# Altium schematic sheet LDO线性7805全分立设计.SchDoc
size 1524 x 1524 mm; SheetNumber: 8; SheetTotal: 17
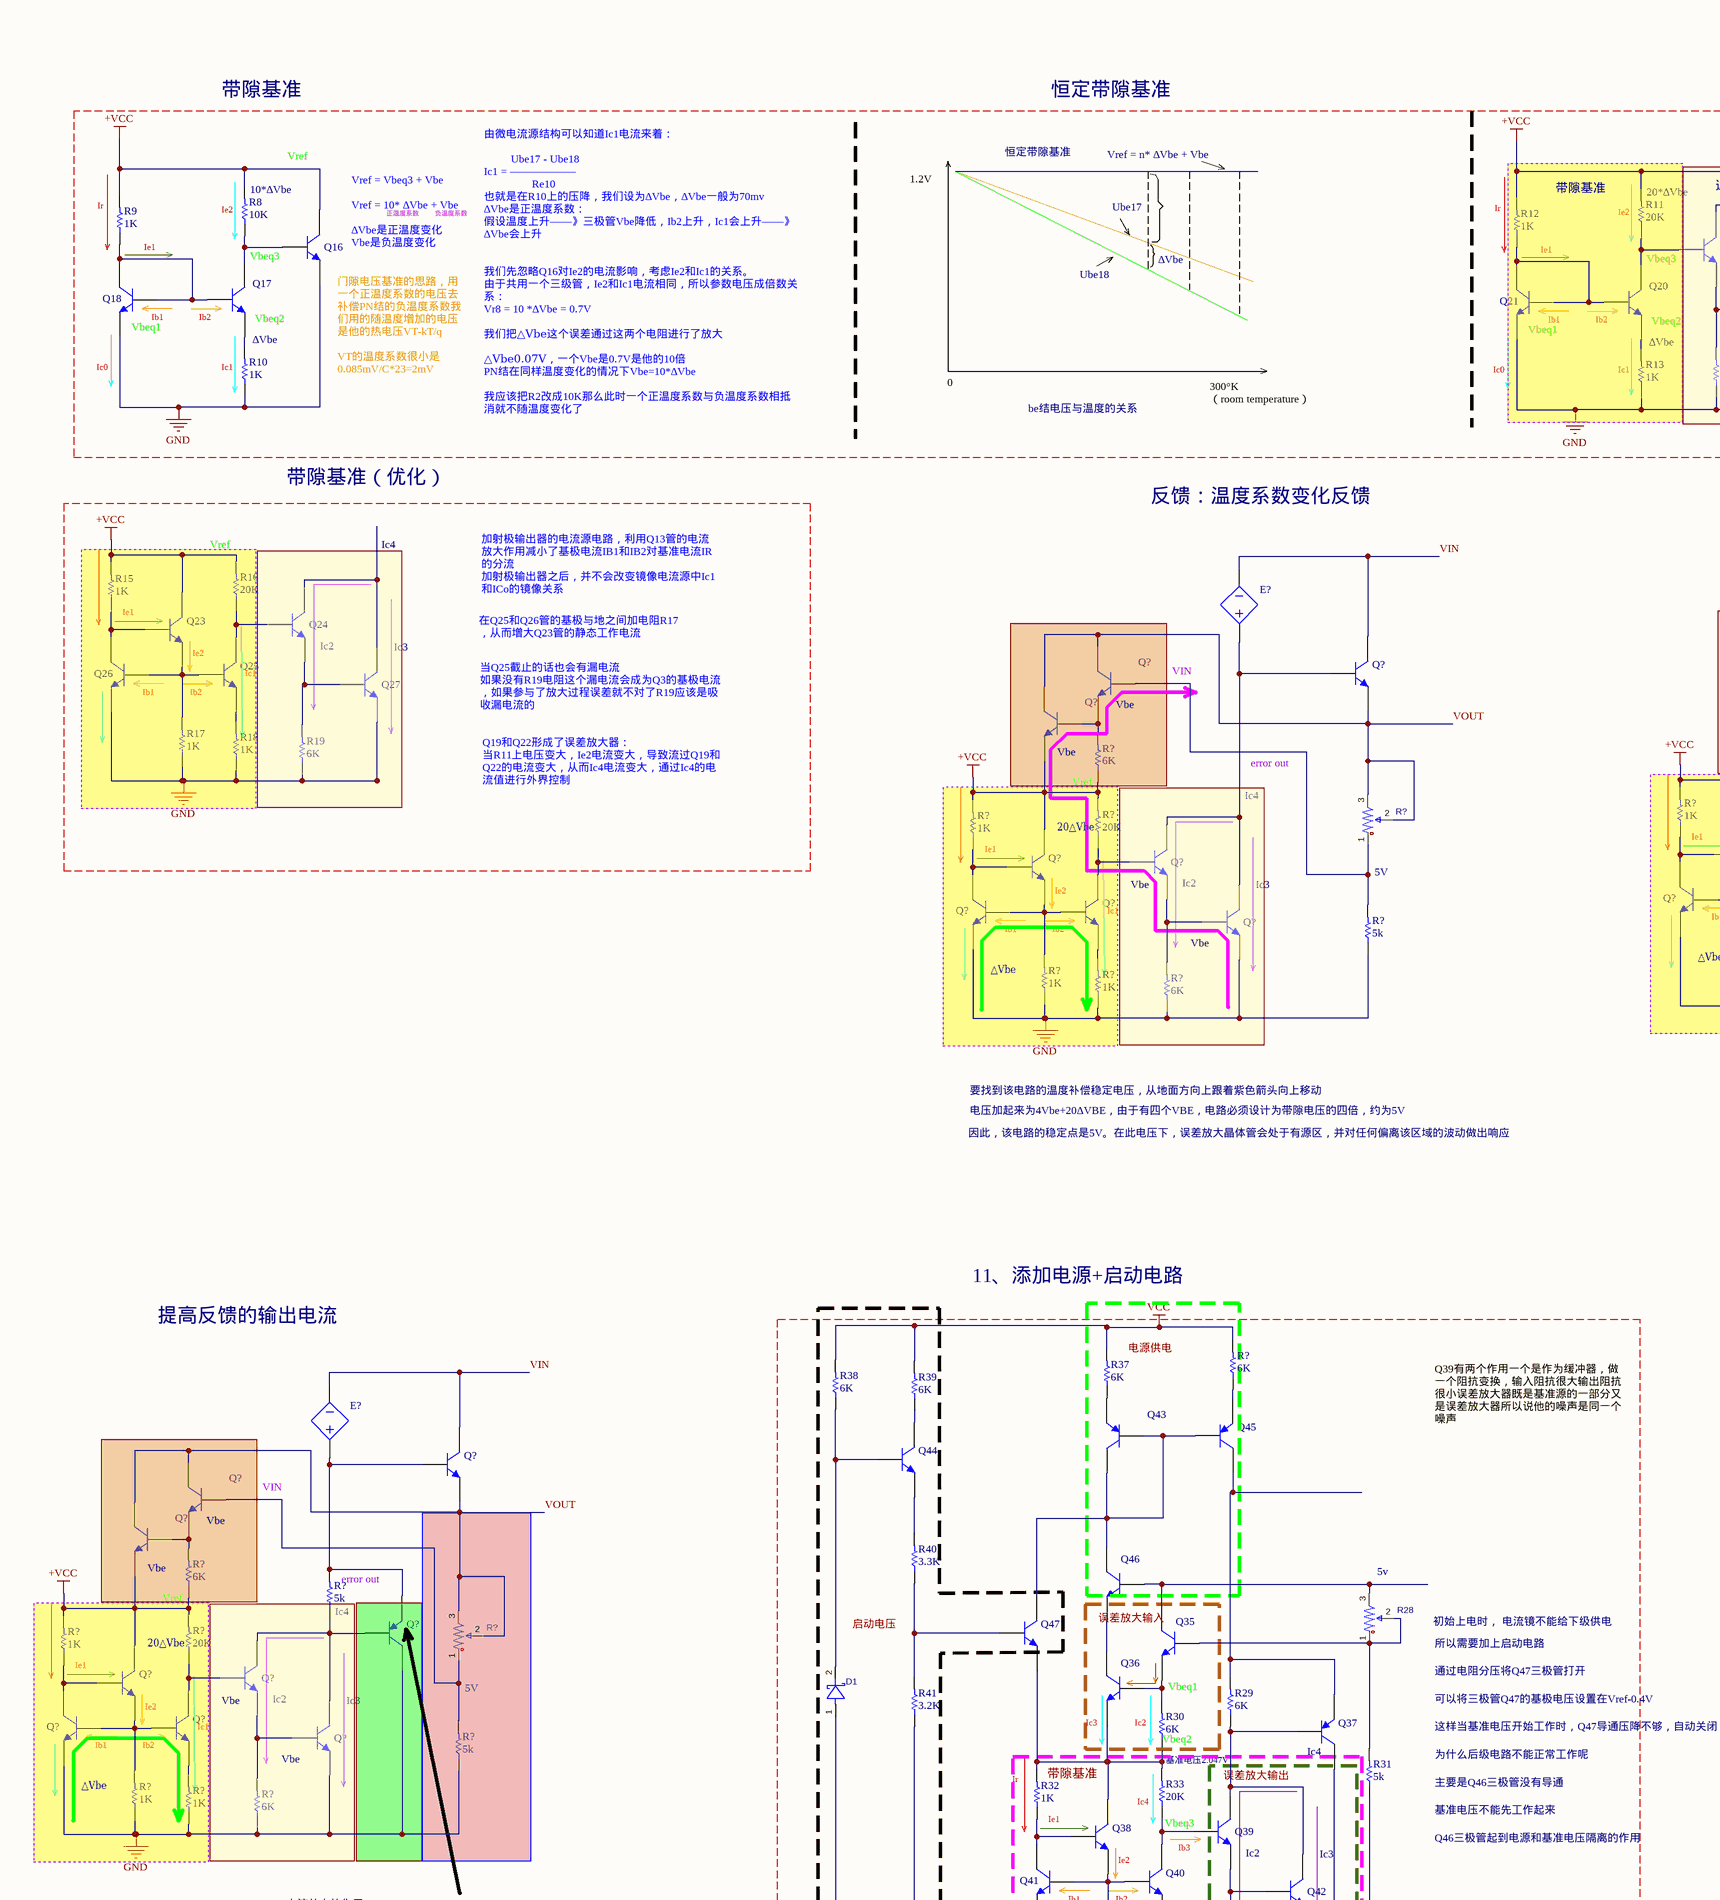
[diagram p0: LDO线性7805全分立设计.SchDoc, top column 1 of 4]
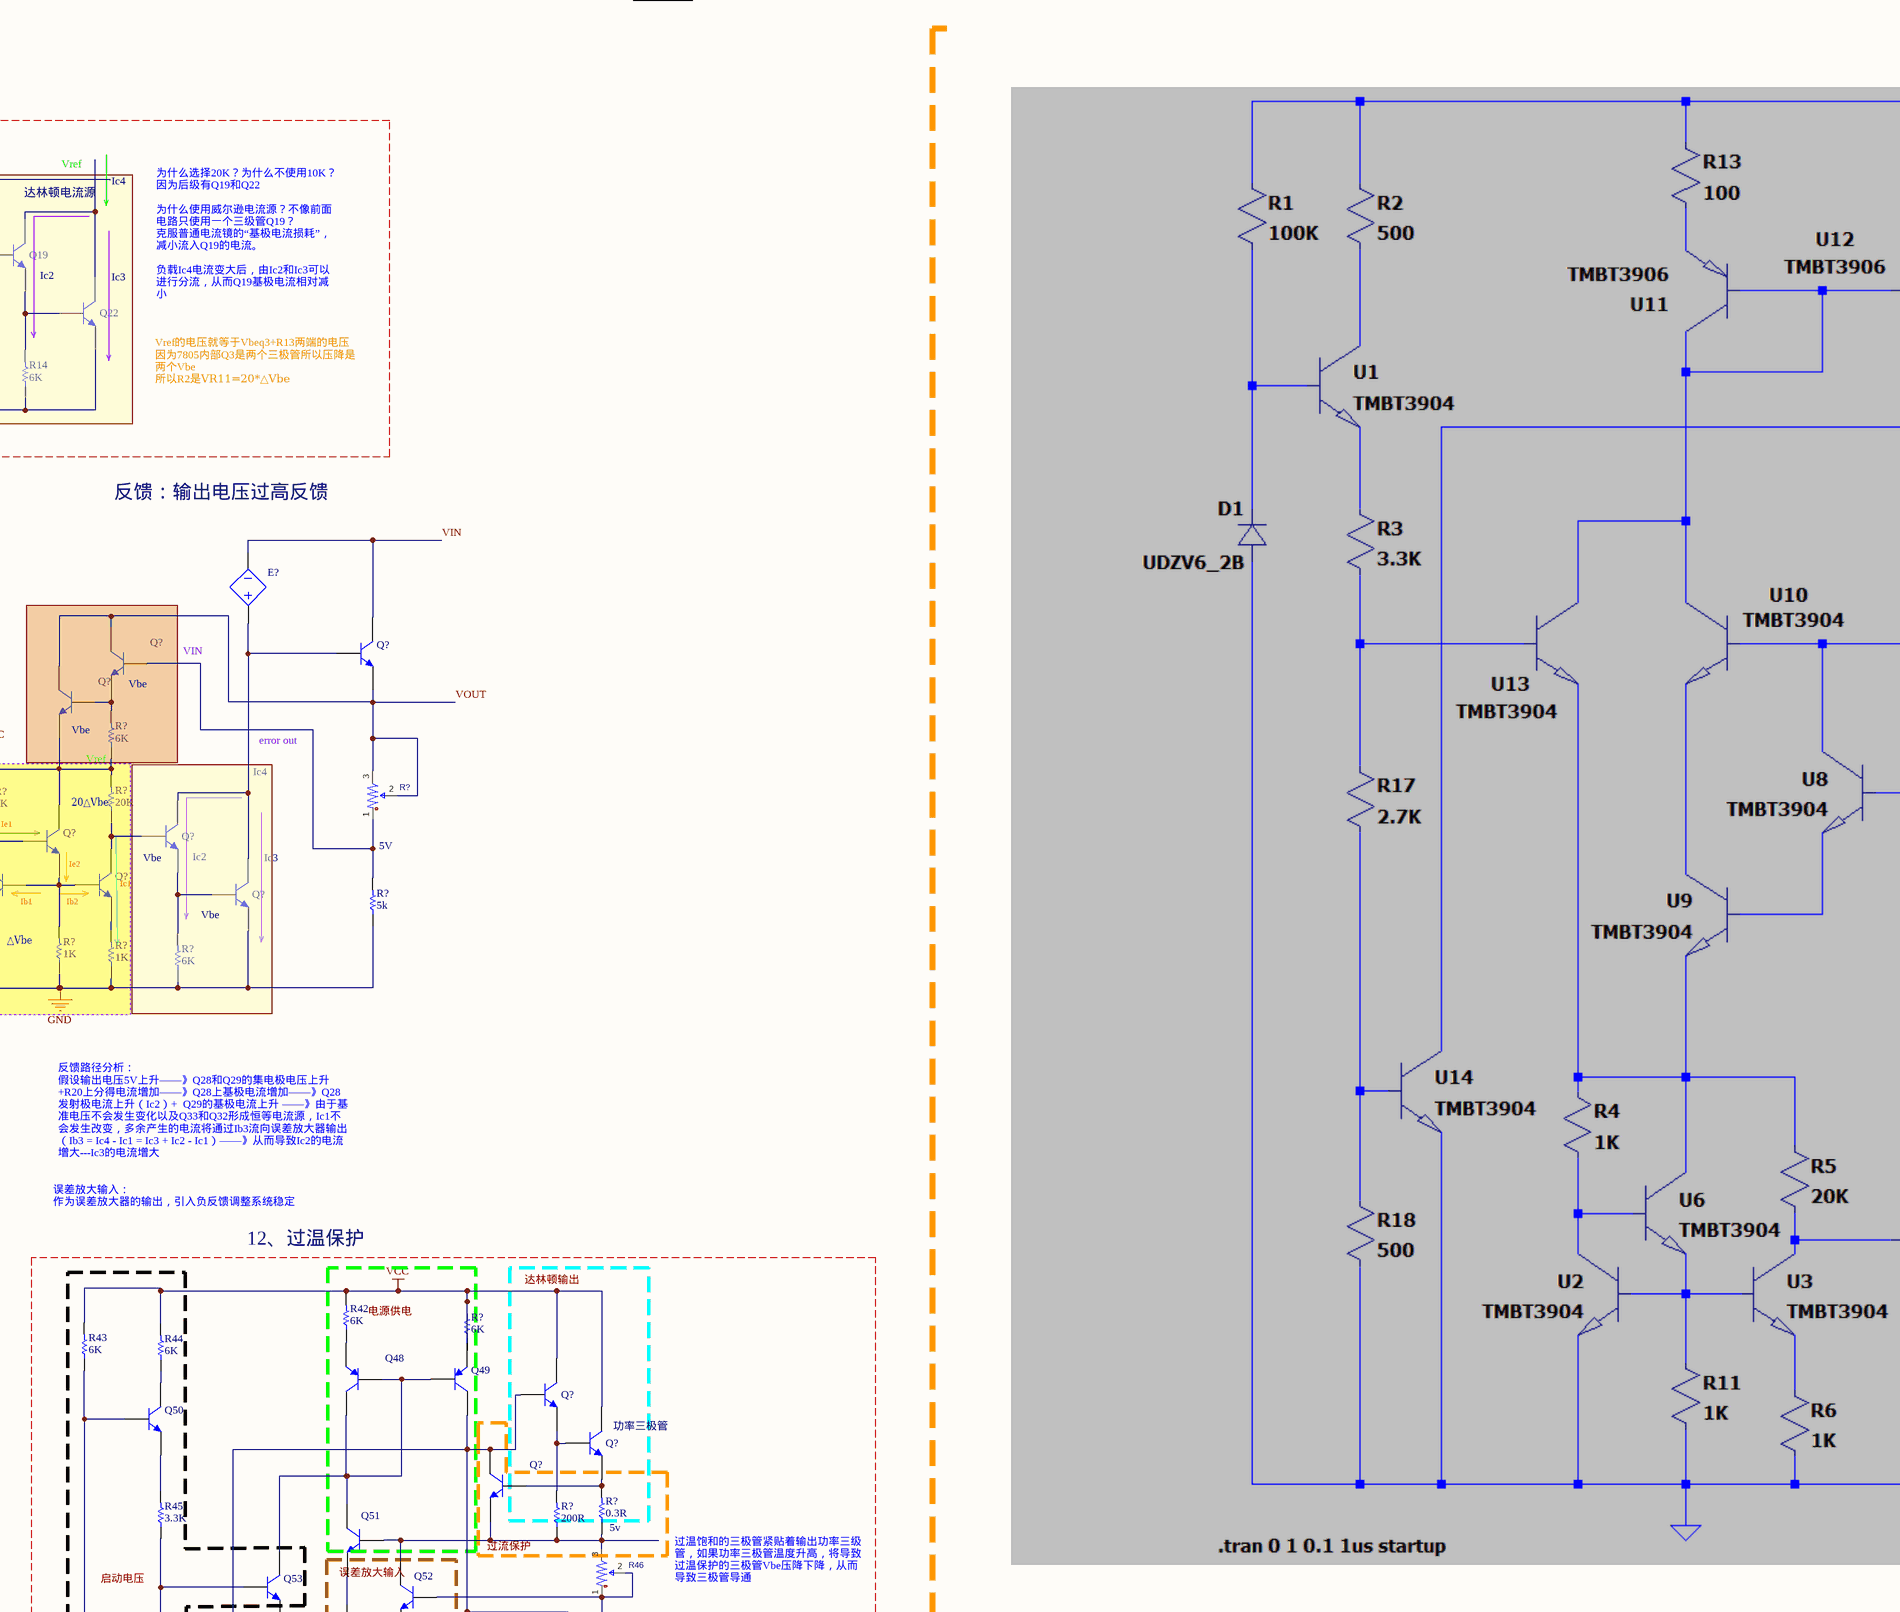
[diagram p1: LDO线性7805全分立设计.SchDoc, top column 2 of 4]
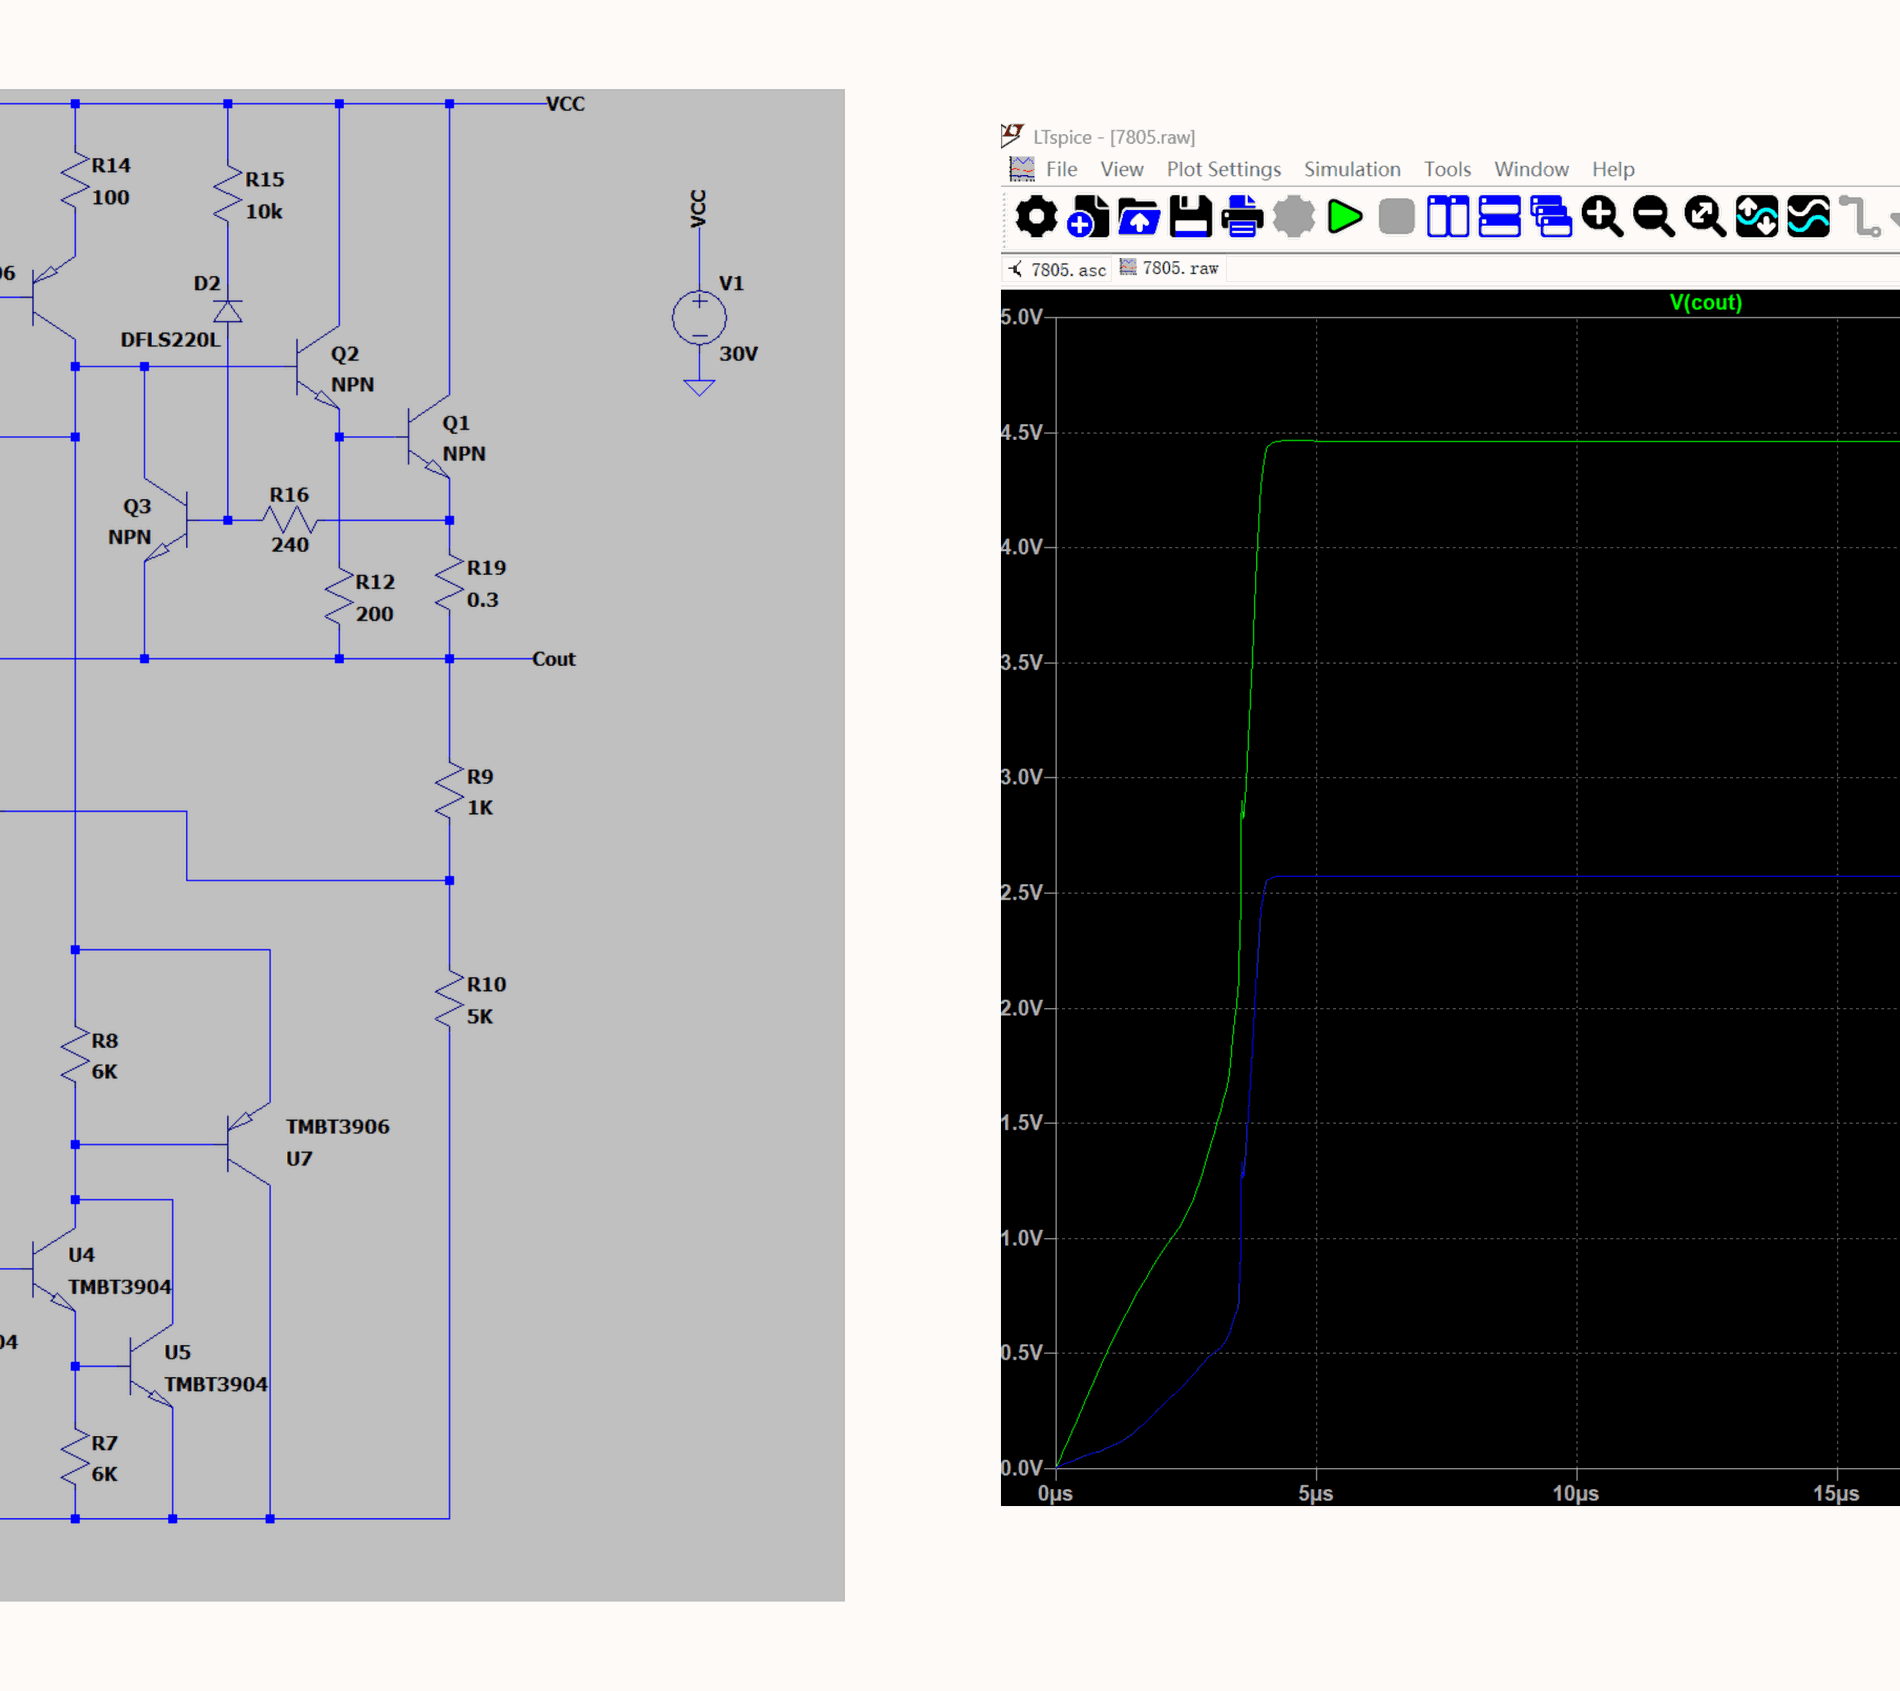
[diagram p2: LDO线性7805全分立设计.SchDoc, top column 3 of 4]
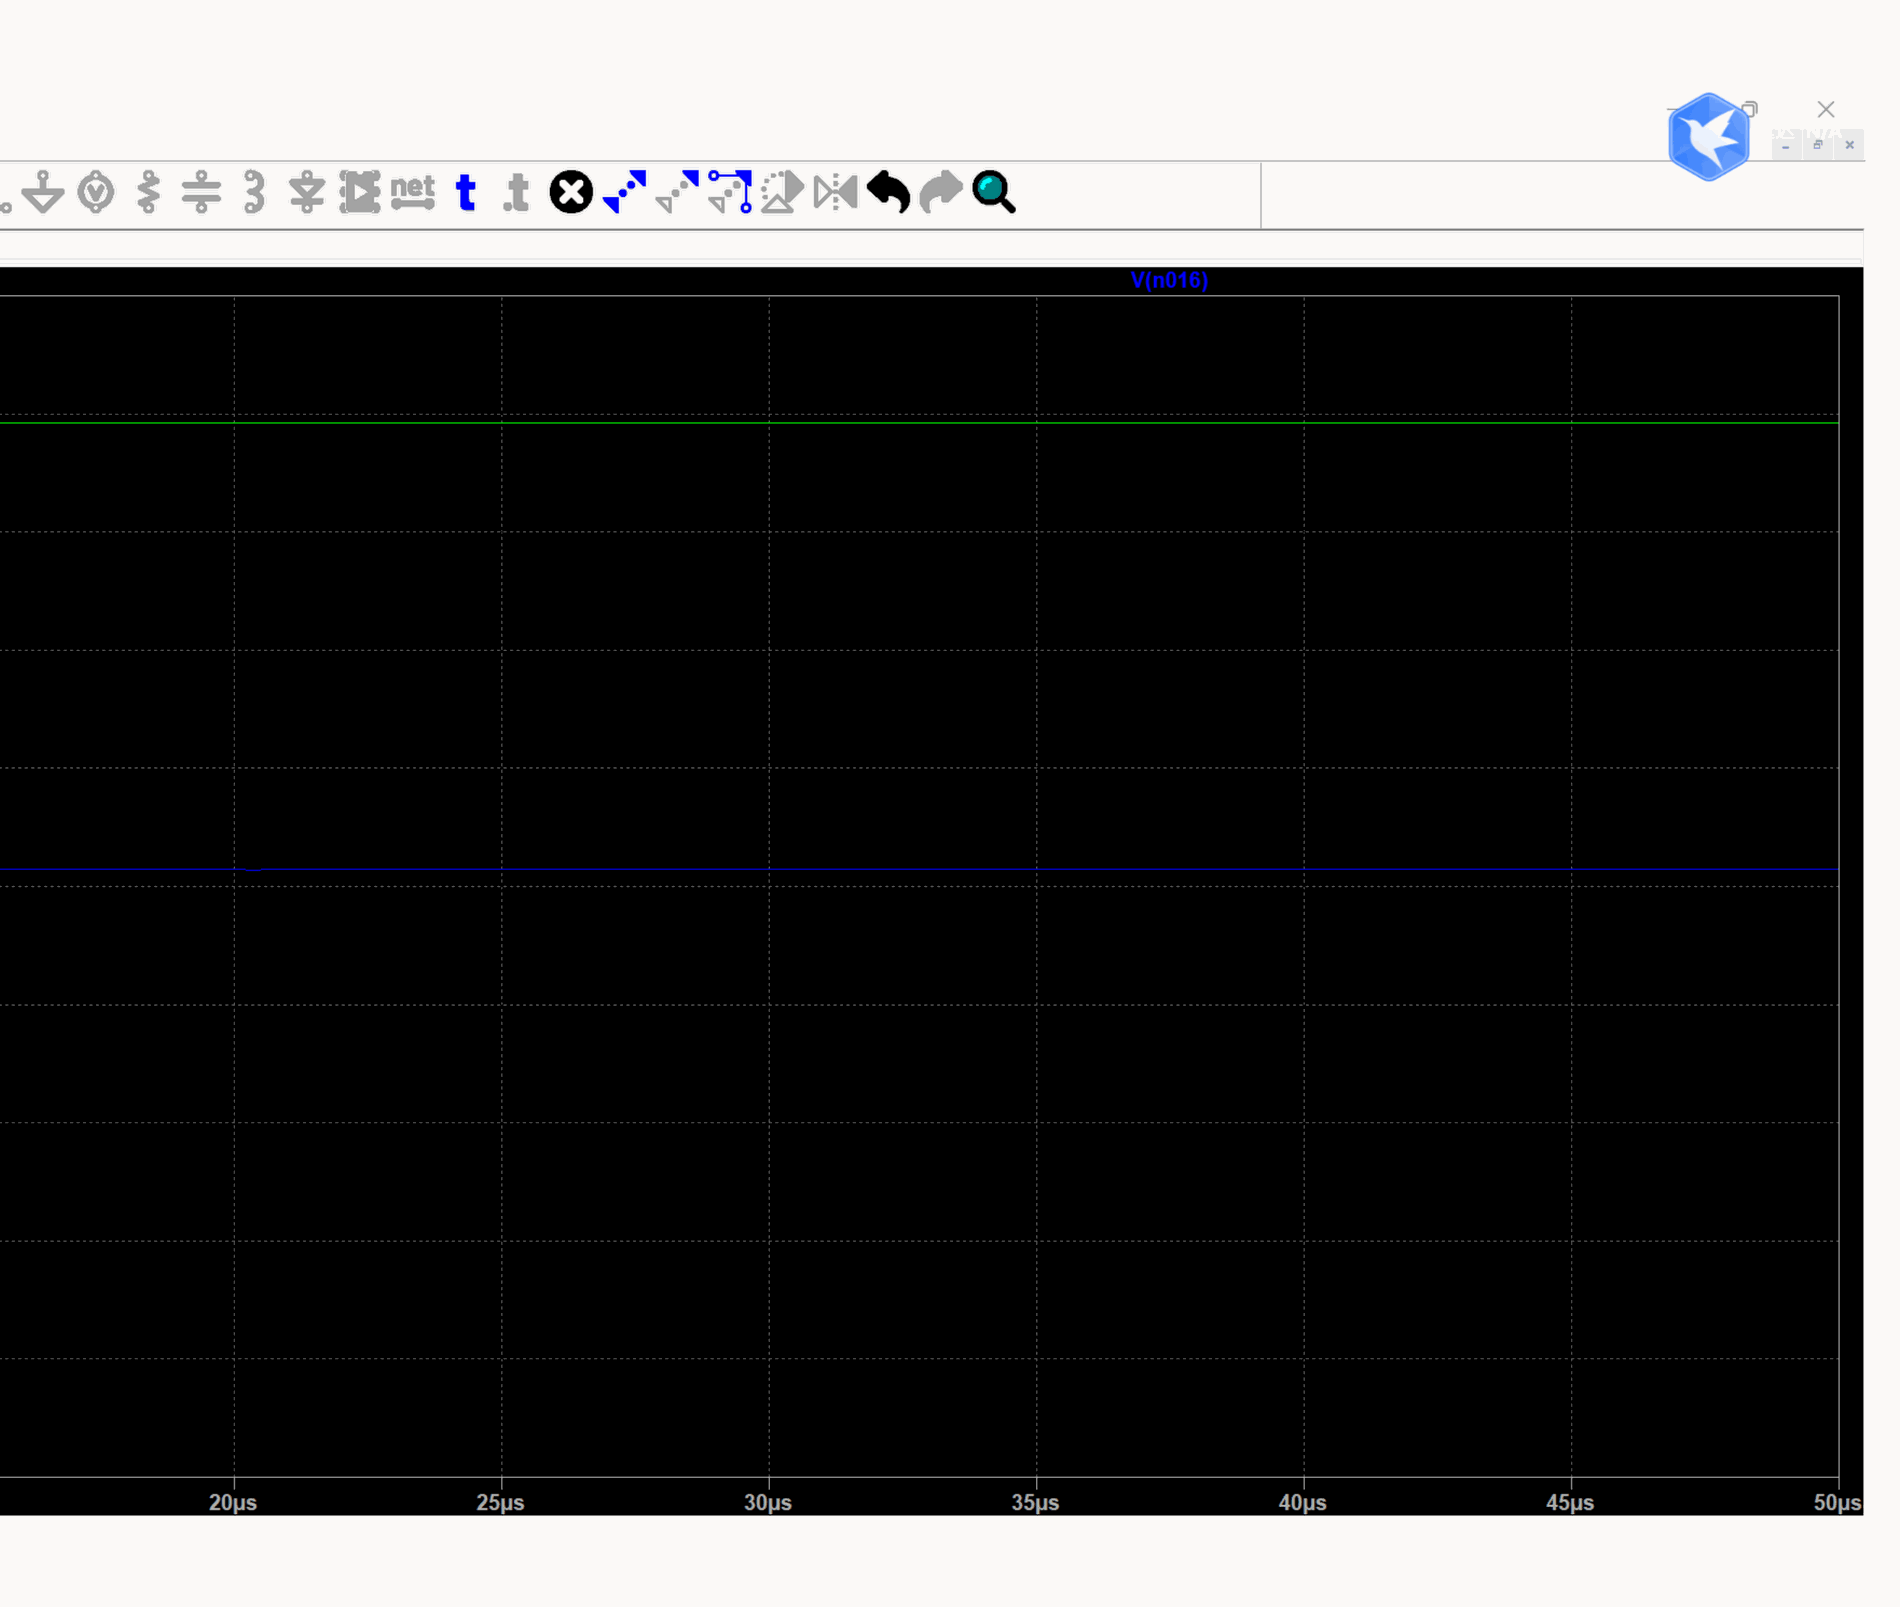
[diagram p3: LDO线性7805全分立设计.SchDoc, top column 4 of 4]
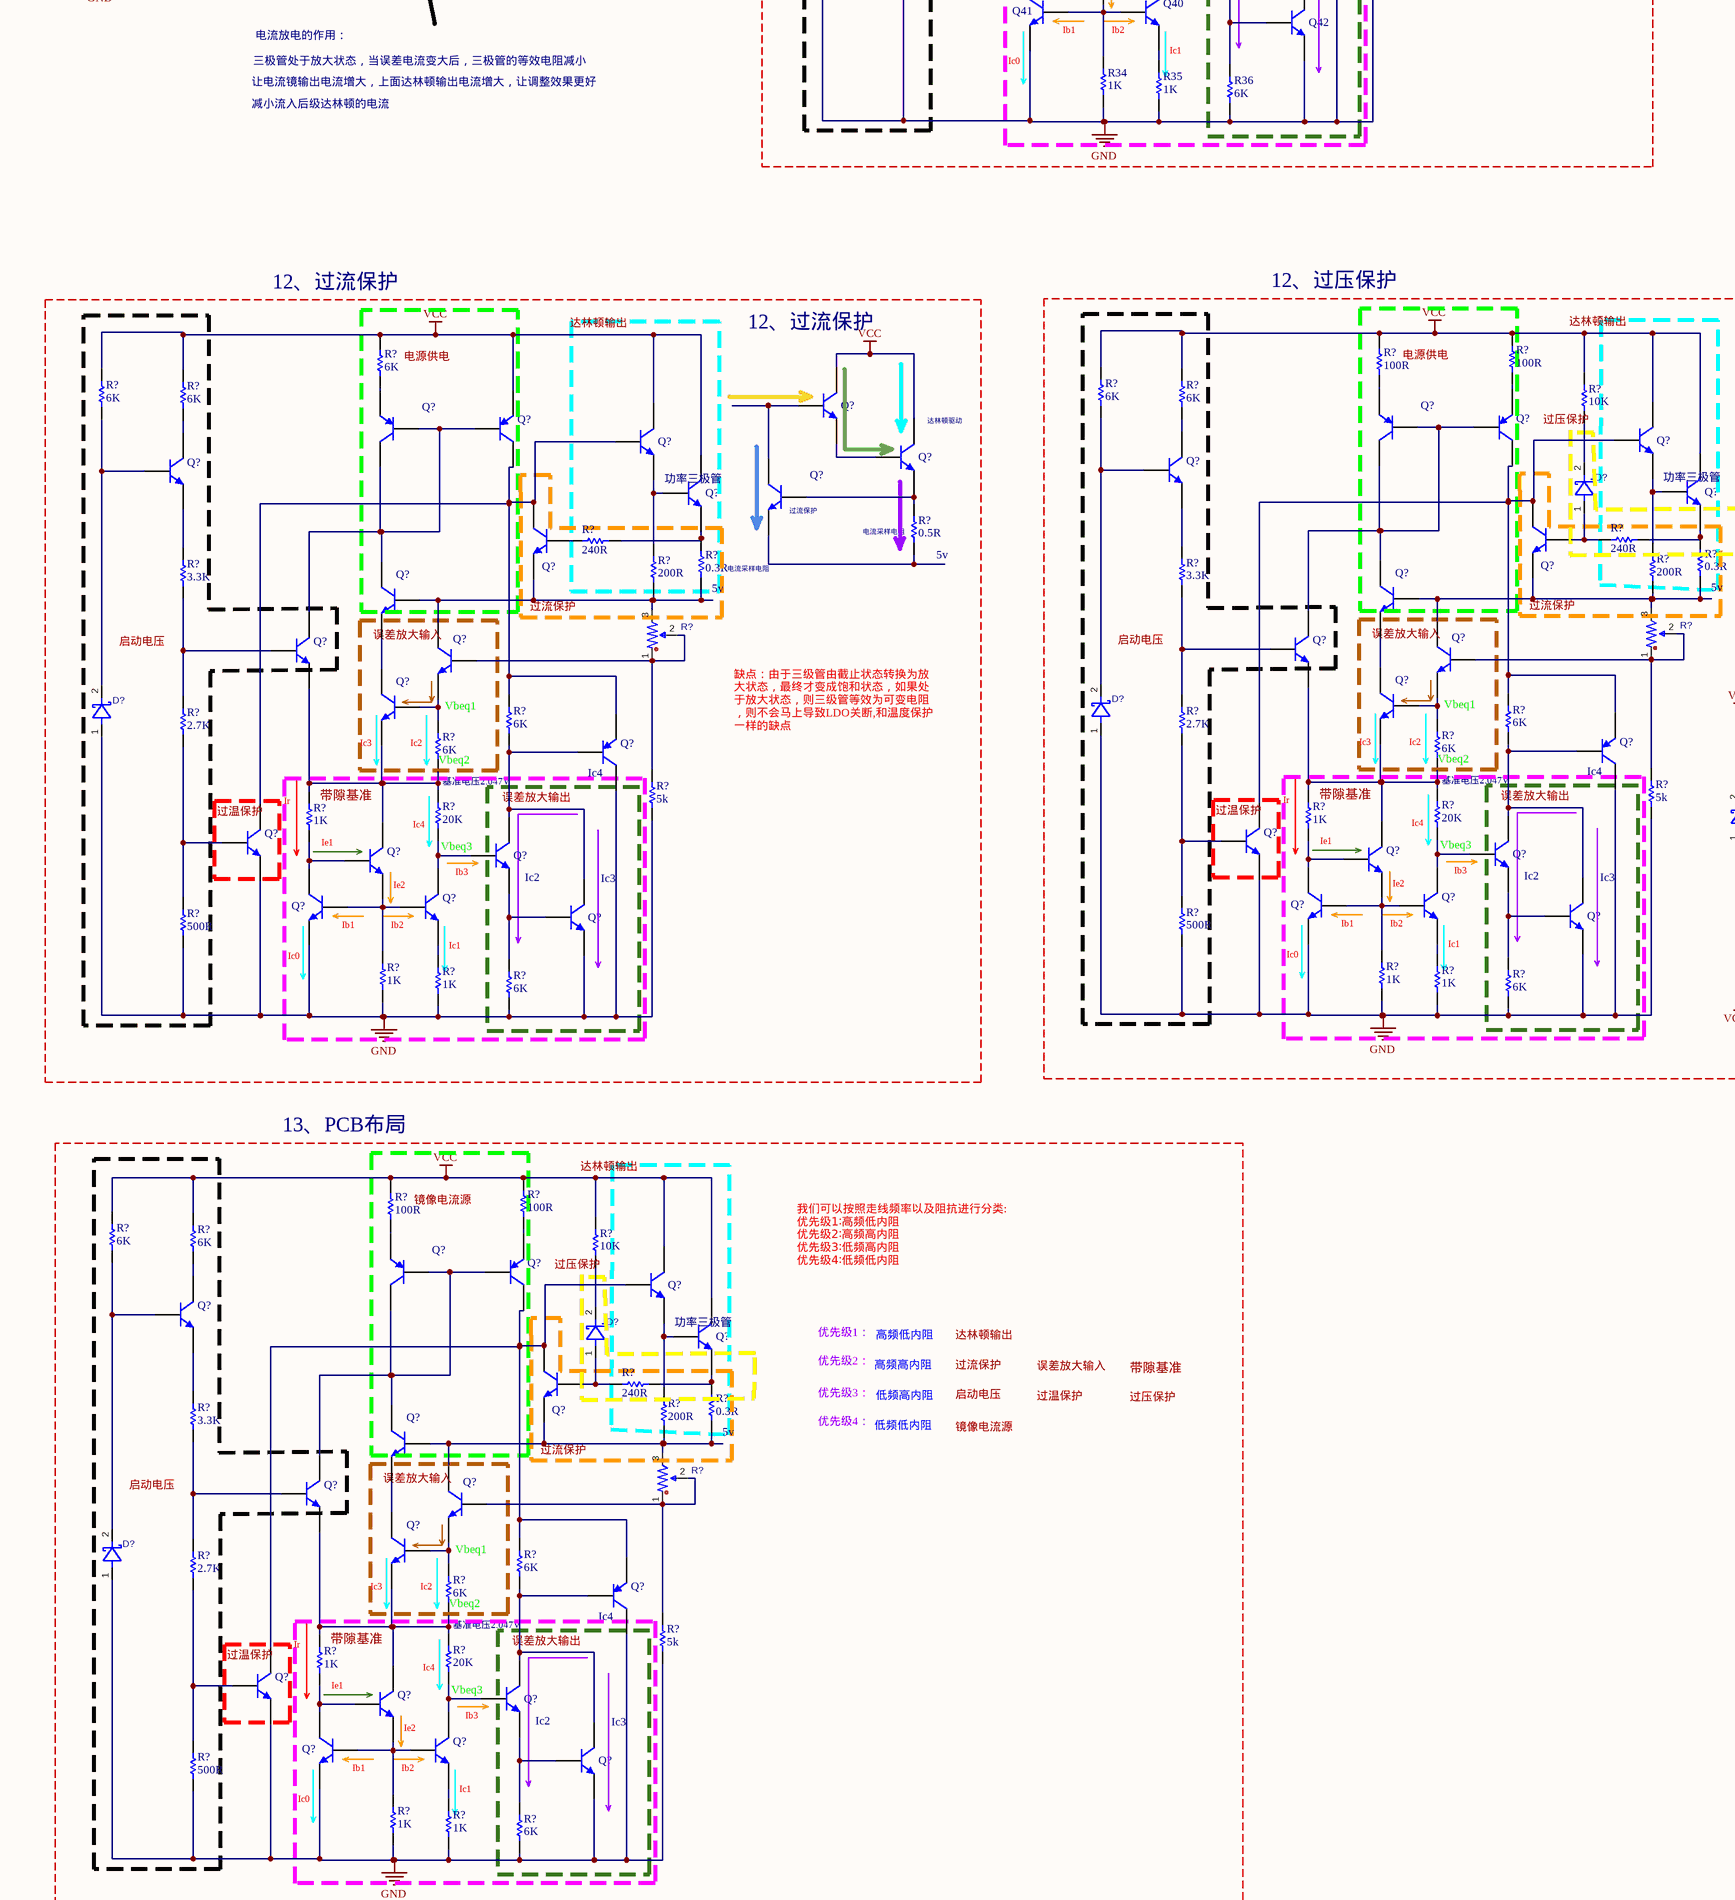
[diagram p4: LDO线性7805全分立设计.SchDoc, centre column 1 of 4]
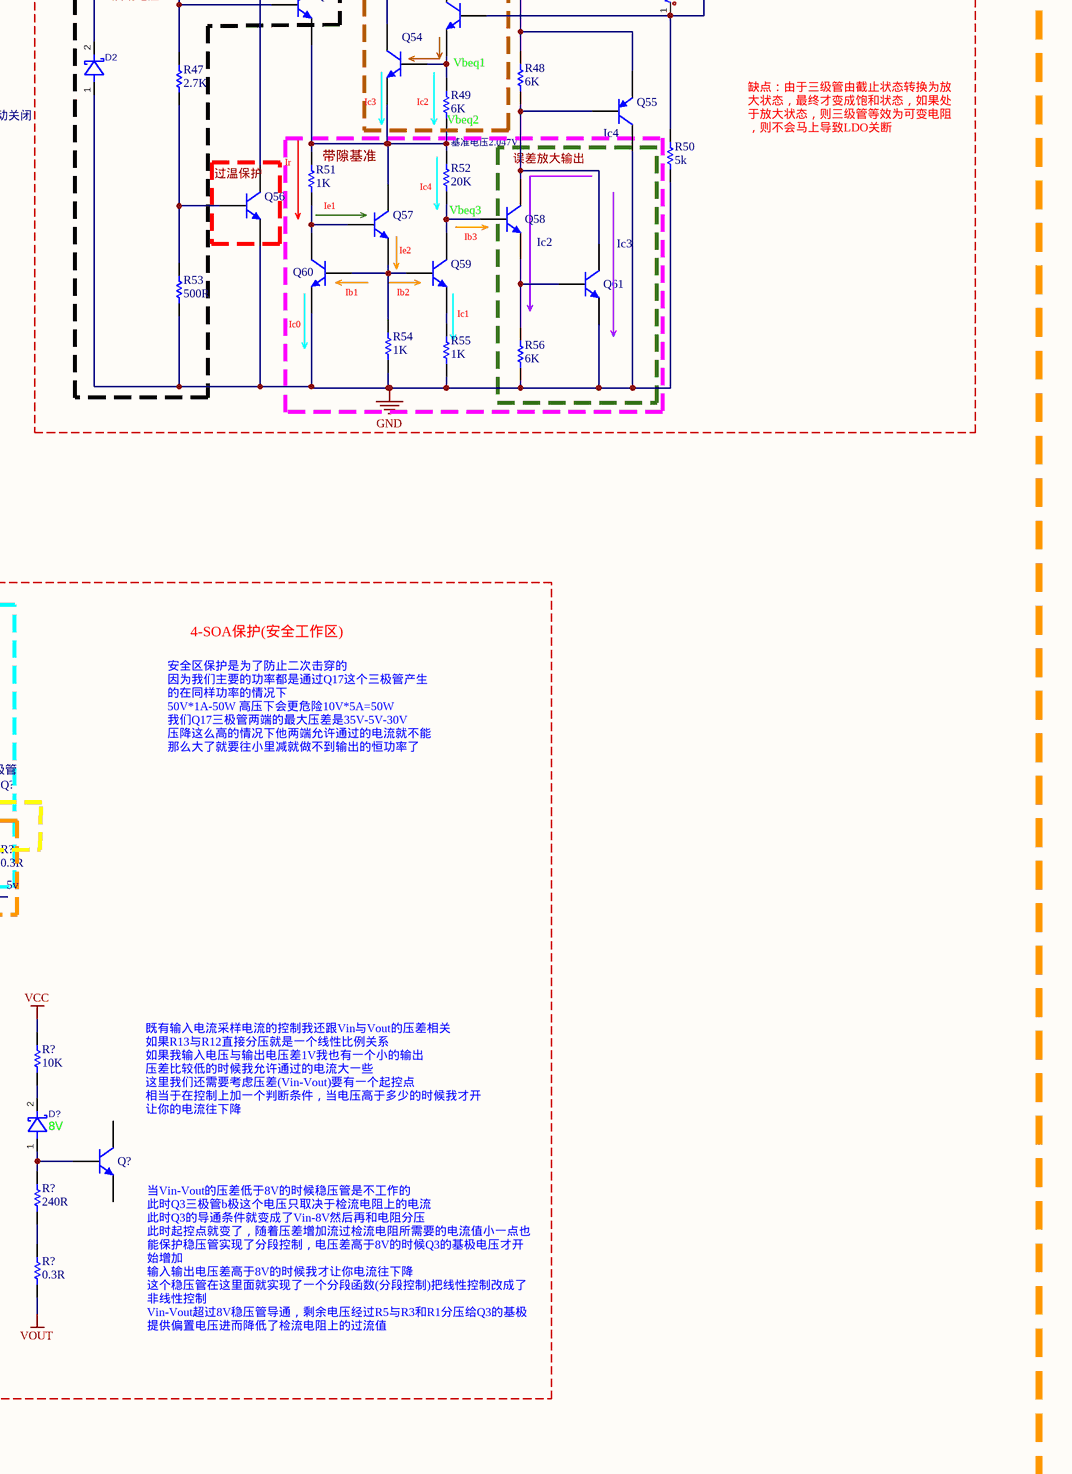
[diagram p5: LDO线性7805全分立设计.SchDoc, centre column 2 of 4]
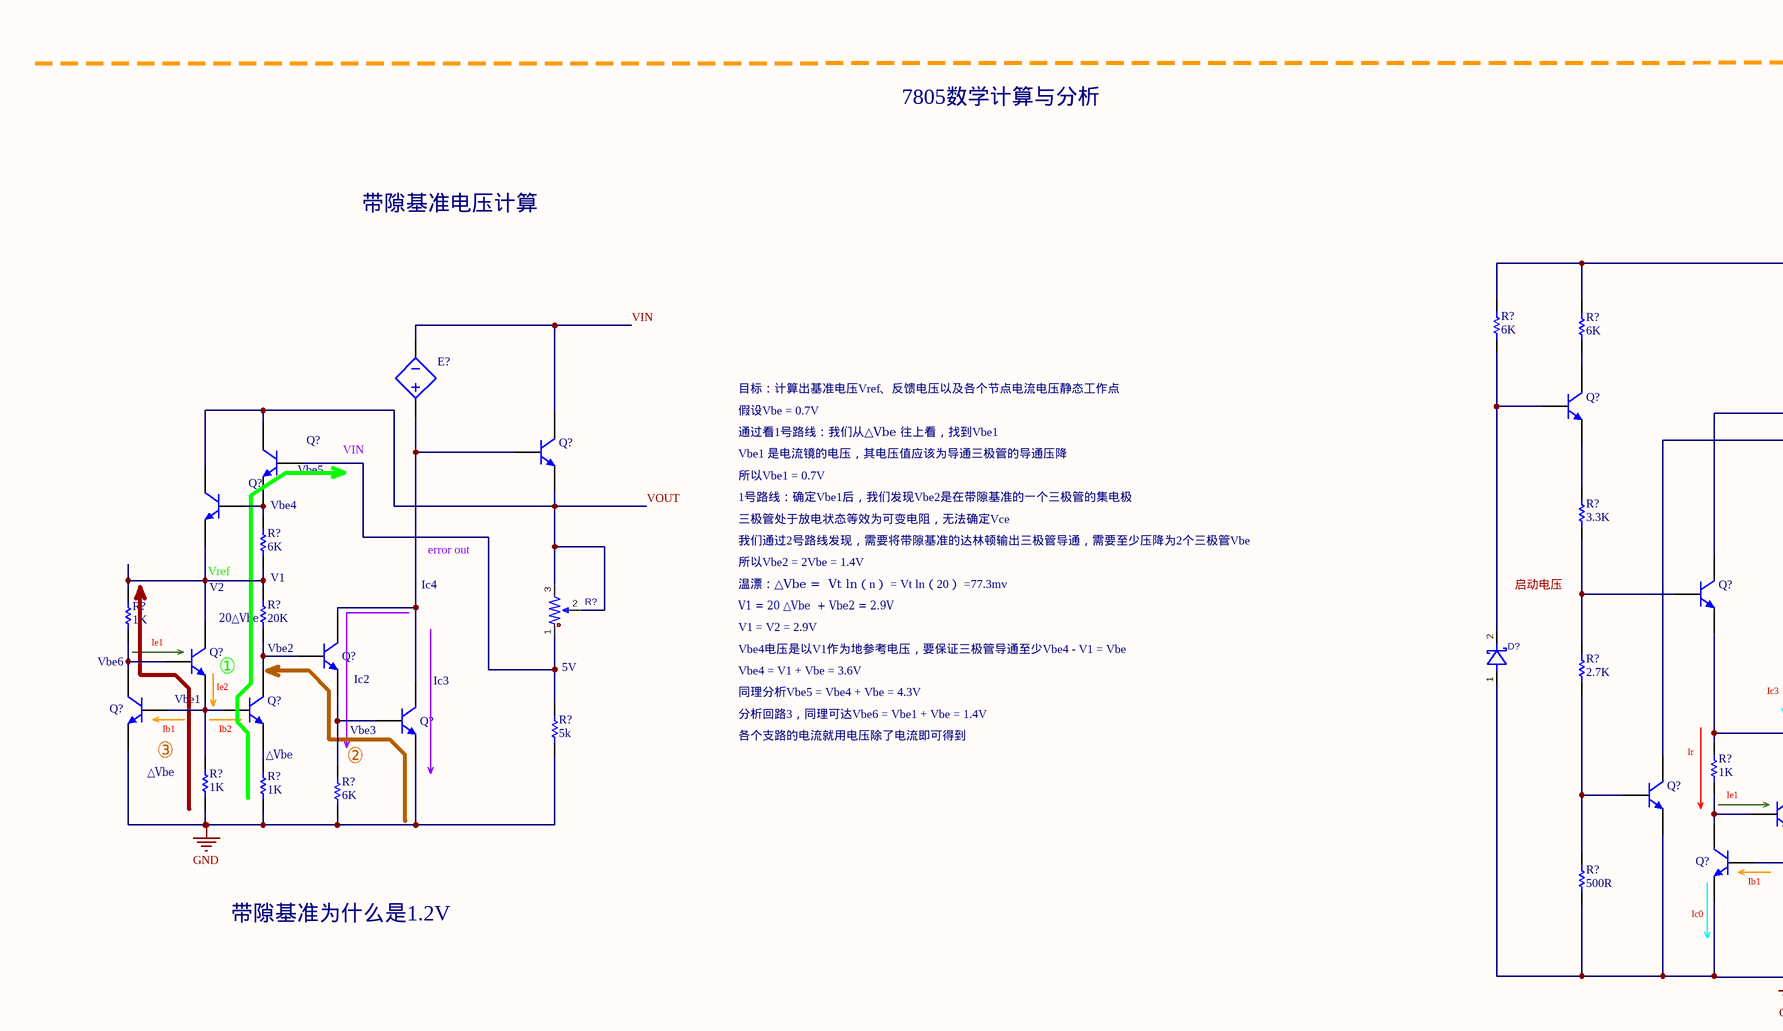
[diagram p6: LDO线性7805全分立设计.SchDoc, bottom column 1 of 4]
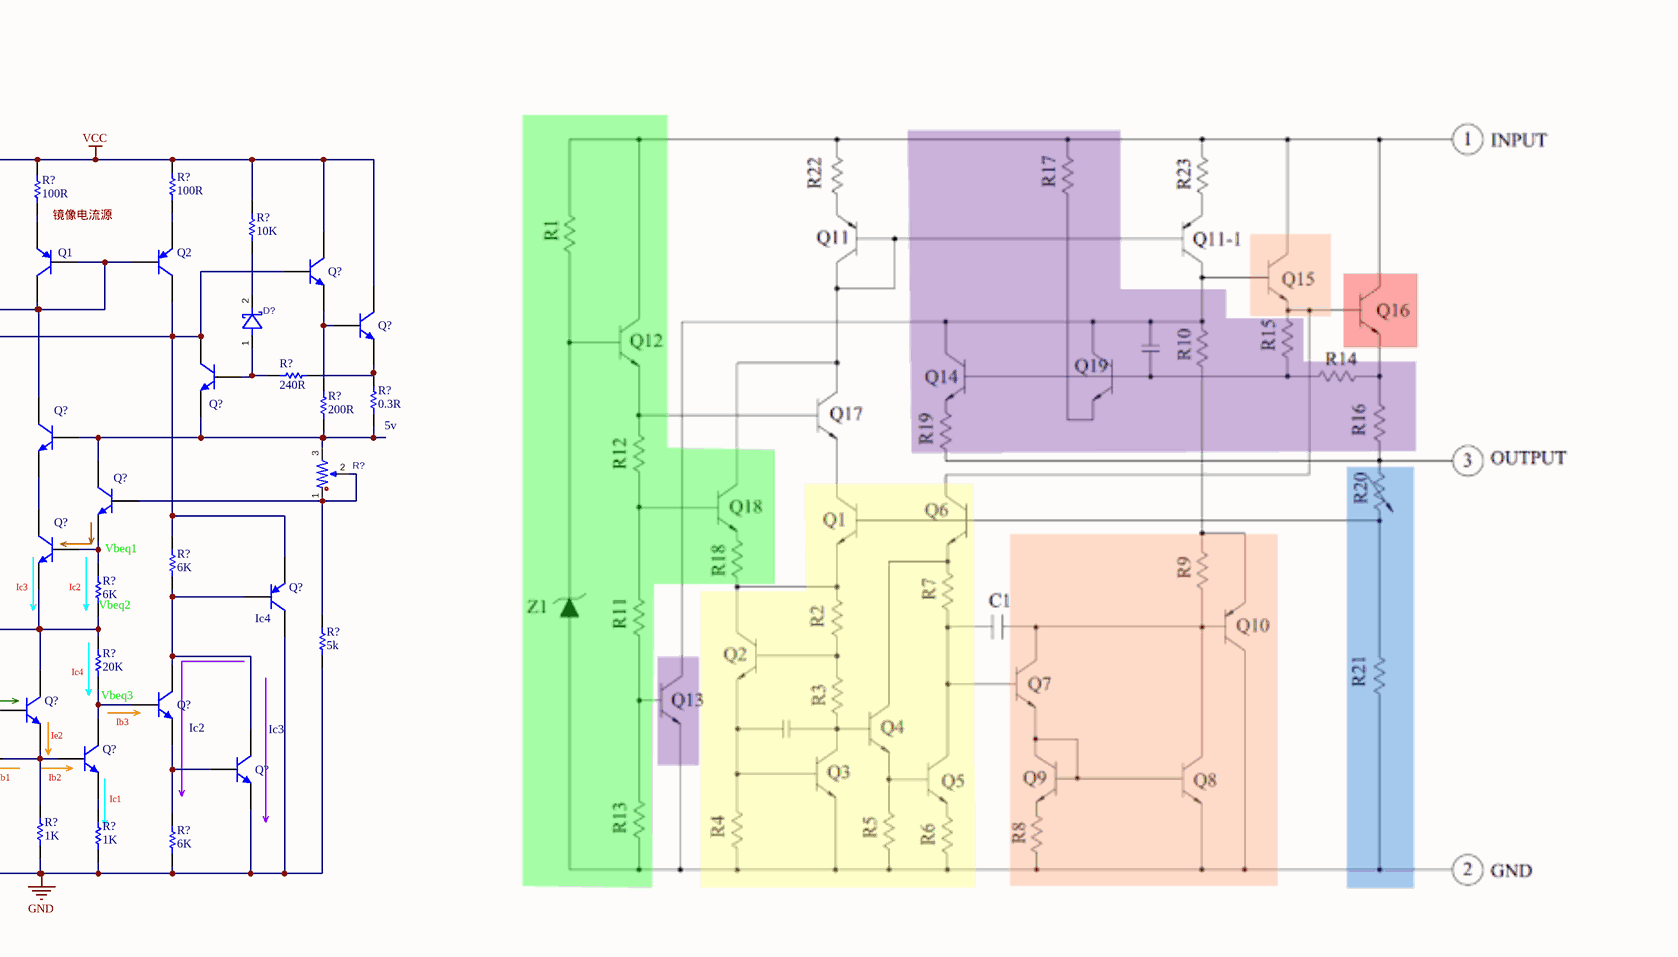
[diagram p7: LDO线性7805全分立设计.SchDoc, bottom column 2 of 4]

## Parts
(Parts that share a designator on the sheet are numbered #1, #2 ... from top to bottom, then left to right.)
D1  1N4148W_C7420318  (value not drawn)
D2  1N4148W_C7420318  (value not drawn)
D?#1  1N4148W_C7420318  (value not drawn)
D?#2  1N4148W_C7420318  (value not drawn)
D?#3  1N4148W_C7420318  (value not drawn)
D?#4  8V
D?#5  1N4148W_C7420318  (value not drawn)
D?#6  1N4148W_C7420318  (value not drawn)
D?#7  1N4148W_C7420318  (value not drawn)
D?#8  1N4148W_C7420318  (value not drawn)
E?#1  Voltage Controlled Voltage Source with SPICE POLY function  (value not drawn)
E?#2  Voltage Controlled Voltage Source with SPICE POLY function  (value not drawn)
E?#3  Voltage Controlled Voltage Source with SPICE POLY function  (value not drawn)
E?#4  Voltage Controlled Voltage Source with SPICE POLY function  (value not drawn)
Q1  Bipolar PNP 3 Pins Transistor Gummel-Poon Model  (value not drawn)
Q2  Bipolar PNP 3 Pins Transistor Gummel-Poon Model  (value not drawn)
Q16  Bipolar NPN 3 Pins Transistor VBIC Model  (value not drawn)
Q17  Bipolar NPN 3 Pins Transistor VBIC Model  (value not drawn)
Q18  Bipolar NPN 3 Pins Transistor VBIC Model  (value not drawn)
Q19  Bipolar NPN 3 Pins Transistor VBIC Model  (value not drawn)
Q20  Bipolar NPN 3 Pins Transistor VBIC Model  (value not drawn)
Q21  Bipolar NPN 3 Pins Transistor VBIC Model  (value not drawn)
Q22  Bipolar NPN 3 Pins Transistor VBIC Model  (value not drawn)
Q23  Bipolar NPN 3 Pins Transistor VBIC Model  (value not drawn)
Q24  Bipolar NPN 3 Pins Transistor VBIC Model  (value not drawn)
Q25  Bipolar NPN 3 Pins Transistor VBIC Model  (value not drawn)
Q26  Bipolar NPN 3 Pins Transistor VBIC Model  (value not drawn)
Q27  Bipolar NPN 3 Pins Transistor VBIC Model  (value not drawn)
Q35  Bipolar NPN 3 Pins Transistor VBIC Model  (value not drawn)
Q36  Bipolar NPN 3 Pins Transistor VBIC Model  (value not drawn)
Q37  Bipolar PNP 3 Pins Transistor Gummel-Poon Model  (value not drawn)
Q38  Bipolar NPN 3 Pins Transistor VBIC Model  (value not drawn)
Q39  Bipolar NPN 3 Pins Transistor VBIC Model  (value not drawn)
Q40  Bipolar NPN 3 Pins Transistor VBIC Model  (value not drawn)
Q41  Bipolar NPN 3 Pins Transistor VBIC Model  (value not drawn)
Q42  Bipolar NPN 3 Pins Transistor VBIC Model  (value not drawn)
Q43  Bipolar PNP 3 Pins Transistor Gummel-Poon Model  (value not drawn)
Q44  Bipolar NPN 3 Pins Transistor VBIC Model  (value not drawn)
Q45  Bipolar PNP 3 Pins Transistor Gummel-Poon Model  (value not drawn)
Q46  Bipolar NPN 3 Pins Transistor VBIC Model  (value not drawn)
Q47  Bipolar NPN 3 Pins Transistor VBIC Model  (value not drawn)
Q48  Bipolar PNP 3 Pins Transistor Gummel-Poon Model  (value not drawn)
Q49  Bipolar PNP 3 Pins Transistor Gummel-Poon Model  (value not drawn)
Q50  Bipolar NPN 3 Pins Transistor VBIC Model  (value not drawn)
Q51  Bipolar NPN 3 Pins Transistor VBIC Model  (value not drawn)
Q52  Bipolar NPN 3 Pins Transistor VBIC Model  (value not drawn)
Q53  Bipolar NPN 3 Pins Transistor VBIC Model  (value not drawn)
Q54  Bipolar NPN 3 Pins Transistor VBIC Model  (value not drawn)
Q55  Bipolar PNP 3 Pins Transistor Gummel-Poon Model  (value not drawn)
Q56  Bipolar NPN 3 Pins Transistor VBIC Model  (value not drawn)
Q57  Bipolar NPN 3 Pins Transistor VBIC Model  (value not drawn)
Q58  Bipolar NPN 3 Pins Transistor VBIC Model  (value not drawn)
Q59  Bipolar NPN 3 Pins Transistor VBIC Model  (value not drawn)
Q60  Bipolar NPN 3 Pins Transistor VBIC Model  (value not drawn)
Q61  Bipolar NPN 3 Pins Transistor VBIC Model  (value not drawn)
Q?#1  Bipolar NPN 3 Pins Transistor VBIC Model  (value not drawn)
Q?#2  Bipolar NPN 3 Pins Transistor VBIC Model  (value not drawn)
Q?#3  Bipolar NPN 3 Pins Transistor VBIC Model  (value not drawn)
Q?#4  Bipolar NPN 3 Pins Transistor VBIC Model  (value not drawn)
Q?#5  Bipolar NPN 3 Pins Transistor VBIC Model  (value not drawn)
Q?#6  Bipolar NPN 3 Pins Transistor VBIC Model  (value not drawn)
Q?#7  Bipolar NPN 3 Pins Transistor VBIC Model  (value not drawn)
Q?#8  Bipolar NPN 3 Pins Transistor VBIC Model  (value not drawn)
Q?#9  Bipolar NPN 3 Pins Transistor VBIC Model  (value not drawn)
Q?#10  Bipolar NPN 3 Pins Transistor VBIC Model  (value not drawn)
Q?#11  Bipolar NPN 3 Pins Transistor VBIC Model  (value not drawn)
Q?#12  Bipolar NPN 3 Pins Transistor VBIC Model  (value not drawn)
Q?#13  Bipolar NPN 3 Pins Transistor VBIC Model  (value not drawn)
Q?#14  Bipolar NPN 3 Pins Transistor VBIC Model  (value not drawn)
Q?#15  Bipolar NPN 3 Pins Transistor VBIC Model  (value not drawn)
Q?#16  Bipolar NPN 3 Pins Transistor VBIC Model  (value not drawn)
Q?#17  Bipolar NPN 3 Pins Transistor VBIC Model  (value not drawn)
Q?#18  Bipolar NPN 3 Pins Transistor VBIC Model  (value not drawn)
Q?#19  Bipolar NPN 3 Pins Transistor VBIC Model  (value not drawn)
Q?#20  Bipolar NPN 3 Pins Transistor VBIC Model  (value not drawn)
Q?#21  Bipolar NPN 3 Pins Transistor VBIC Model  (value not drawn)
Q?#22  Bipolar NPN 3 Pins Transistor VBIC Model  (value not drawn)
Q?#23  Bipolar PNP 3 Pins Transistor Gummel-Poon Model  (value not drawn)
Q?#24  Bipolar NPN 3 Pins Transistor VBIC Model  (value not drawn)
Q?#25  Bipolar NPN 3 Pins Transistor VBIC Model  (value not drawn)
Q?#26  Bipolar NPN 3 Pins Transistor VBIC Model  (value not drawn)
Q?#27  Bipolar NPN 3 Pins Transistor VBIC Model  (value not drawn)
Q?#28  Bipolar NPN 3 Pins Transistor VBIC Model  (value not drawn)
Q?#29  Bipolar NPN 3 Pins Transistor VBIC Model  (value not drawn)
Q?#30  Bipolar PNP 3 Pins Transistor Gummel-Poon Model  (value not drawn)
Q?#31  Bipolar PNP 3 Pins Transistor Gummel-Poon Model  (value not drawn)
Q?#32  Bipolar PNP 3 Pins Transistor Gummel-Poon Model  (value not drawn)
Q?#33  Bipolar PNP 3 Pins Transistor Gummel-Poon Model  (value not drawn)
Q?#34  Bipolar NPN 3 Pins Transistor VBIC Model  (value not drawn)
Q?#35  Bipolar NPN 3 Pins Transistor VBIC Model  (value not drawn)
Q?#36  Bipolar NPN 3 Pins Transistor VBIC Model  (value not drawn)
Q?#37  Bipolar NPN 3 Pins Transistor VBIC Model  (value not drawn)
Q?#38  Bipolar NPN 3 Pins Transistor VBIC Model  (value not drawn)
Q?#39  Bipolar NPN 3 Pins Transistor VBIC Model  (value not drawn)
Q?#40  Bipolar NPN 3 Pins Transistor VBIC Model  (value not drawn)
Q?#41  Bipolar NPN 3 Pins Transistor VBIC Model  (value not drawn)
Q?#42  Bipolar NPN 3 Pins Transistor VBIC Model  (value not drawn)
Q?#43  Bipolar NPN 3 Pins Transistor VBIC Model  (value not drawn)
Q?#44  Bipolar NPN 3 Pins Transistor VBIC Model  (value not drawn)
Q?#45  Bipolar NPN 3 Pins Transistor VBIC Model  (value not drawn)
Q?#46  Bipolar NPN 3 Pins Transistor VBIC Model  (value not drawn)
Q?#47  Bipolar NPN 3 Pins Transistor VBIC Model  (value not drawn)
Q?#48  Bipolar NPN 3 Pins Transistor VBIC Model  (value not drawn)
Q?#49  Bipolar NPN 3 Pins Transistor VBIC Model  (value not drawn)
Q?#50  Bipolar NPN 3 Pins Transistor VBIC Model  (value not drawn)
Q?#51  Bipolar NPN 3 Pins Transistor VBIC Model  (value not drawn)
Q?#52  Bipolar PNP 3 Pins Transistor Gummel-Poon Model  (value not drawn)
Q?#53  Bipolar PNP 3 Pins Transistor Gummel-Poon Model  (value not drawn)
Q?#54  Bipolar NPN 3 Pins Transistor VBIC Model  (value not drawn)
Q?#55  Bipolar NPN 3 Pins Transistor VBIC Model  (value not drawn)
Q?#56  Bipolar NPN 3 Pins Transistor VBIC Model  (value not drawn)
Q?#57  Bipolar NPN 3 Pins Transistor VBIC Model  (value not drawn)
Q?#58  Bipolar NPN 3 Pins Transistor VBIC Model  (value not drawn)
Q?#59  Bipolar NPN 3 Pins Transistor VBIC Model  (value not drawn)
Q?#60  Bipolar NPN 3 Pins Transistor VBIC Model  (value not drawn)
Q?#61  Bipolar NPN 3 Pins Transistor VBIC Model  (value not drawn)
Q?#62  Bipolar NPN 3 Pins Transistor VBIC Model  (value not drawn)
Q?#63  Bipolar NPN 3 Pins Transistor VBIC Model  (value not drawn)
Q?#64  Bipolar NPN 3 Pins Transistor VBIC Model  (value not drawn)
Q?#65  Bipolar NPN 3 Pins Transistor VBIC Model  (value not drawn)
Q?#66  Bipolar NPN 3 Pins Transistor VBIC Model  (value not drawn)
Q?#67  Bipolar PNP 3 Pins Transistor Gummel-Poon Model  (value not drawn)
Q?#68  Bipolar PNP 3 Pins Transistor Gummel-Poon Model  (value not drawn)
Q?#69  Bipolar NPN 3 Pins Transistor VBIC Model  (value not drawn)
Q?#70  Bipolar NPN 3 Pins Transistor VBIC Model  (value not drawn)
Q?#71  Bipolar NPN 3 Pins Transistor VBIC Model  (value not drawn)
Q?#72  Bipolar NPN 3 Pins Transistor VBIC Model  (value not drawn)
Q?#73  Bipolar NPN 3 Pins Transistor VBIC Model  (value not drawn)
Q?#74  Bipolar NPN 3 Pins Transistor VBIC Model  (value not drawn)
Q?#75  Bipolar NPN 3 Pins Transistor VBIC Model  (value not drawn)
Q?#76  Bipolar NPN 3 Pins Transistor VBIC Model  (value not drawn)
Q?#77  Bipolar PNP 3 Pins Transistor Gummel-Poon Model  (value not drawn)
Q?#78  Bipolar NPN 3 Pins Transistor VBIC Model  (value not drawn)
Q?#79  Bipolar NPN 3 Pins Transistor VBIC Model  (value not drawn)
Q?#80  Bipolar NPN 3 Pins Transistor VBIC Model  (value not drawn)
Q?#81  Bipolar NPN 3 Pins Transistor VBIC Model  (value not drawn)
Q?#82  Bipolar NPN 3 Pins Transistor VBIC Model  (value not drawn)
Q?#83  Bipolar NPN 3 Pins Transistor VBIC Model  (value not drawn)
Q?#84  Bipolar NPN 3 Pins Transistor VBIC Model  (value not drawn)
Q?#85  Bipolar NPN 3 Pins Transistor VBIC Model  (value not drawn)
Q?#86  Bipolar NPN 3 Pins Transistor VBIC Model  (value not drawn)
Q?#87  Bipolar NPN 3 Pins Transistor VBIC Model  (value not drawn)
Q?#88  Bipolar NPN 3 Pins Transistor VBIC Model  (value not drawn)
Q?#89  Bipolar NPN 3 Pins Transistor VBIC Model  (value not drawn)
Q?#90  Bipolar NPN 3 Pins Transistor VBIC Model  (value not drawn)
Q?#91  Bipolar NPN 3 Pins Transistor VBIC Model  (value not drawn)
Q?#92  Bipolar NPN 3 Pins Transistor VBIC Model  (value not drawn)
Q?#93  Bipolar NPN 3 Pins Transistor VBIC Model  (value not drawn)
Q?#94  Bipolar NPN 3 Pins Transistor VBIC Model  (value not drawn)
Q?#95  Bipolar NPN 3 Pins Transistor VBIC Model  (value not drawn)
Q?#96  Bipolar NPN 3 Pins Transistor VBIC Model  (value not drawn)
Q?#97  Bipolar PNP 3 Pins Transistor Gummel-Poon Model  (value not drawn)
Q?#98  Bipolar NPN 3 Pins Transistor VBIC Model  (value not drawn)
Q?#99  Bipolar NPN 3 Pins Transistor VBIC Model  (value not drawn)
Q?#100  Bipolar NPN 3 Pins Transistor VBIC Model  (value not drawn)
Q?#101  Bipolar NPN 3 Pins Transistor VBIC Model  (value not drawn)
Q?#102  Bipolar NPN 3 Pins Transistor VBIC Model  (value not drawn)
Q?#103  Bipolar NPN 3 Pins Transistor VBIC Model  (value not drawn)
Q?#104  Bipolar NPN 3 Pins Transistor VBIC Model  (value not drawn)
Q?#105  Bipolar NPN 3 Pins Transistor VBIC Model  (value not drawn)
Q?#106  Bipolar NPN 3 Pins Transistor VBIC Model  (value not drawn)
R8  value 10K  (hidden comment: Resistor)
R9  value 1K  (hidden comment: Resistor)
R10  value 1K  (hidden comment: Resistor)
R11  value 20K  (hidden comment: Resistor)
R12  value 1K  (hidden comment: Resistor)
R13  value 1K  (hidden comment: Resistor)
R14  value 6K  (hidden comment: Resistor)
R15  value 1K  (hidden comment: Resistor)
R16  value 20K  (hidden comment: Resistor)
R17  value 1K  (hidden comment: Resistor)
R18  value 1K  (hidden comment: Resistor)
R19  value 6K  (hidden comment: Resistor)
R28  3296W-1-103_C48997937  (value not drawn)
R29  value 6K  (hidden comment: Resistor)
R30  value 6K  (hidden comment: Resistor)
R31  value 5k  (hidden comment: Resistor)
R32  value 1K  (hidden comment: Resistor)
R33  value 20K  (hidden comment: Resistor)
R34  value 1K  (hidden comment: Resistor)
R35  value 1K  (hidden comment: Resistor)
R36  value 6K  (hidden comment: Resistor)
R37  value 6K  (hidden comment: Resistor)
R38  value 6K  (hidden comment: Resistor)
R39  value 6K  (hidden comment: Resistor)
R40  value 3.3K  (hidden comment: Resistor)
R41  value 3.2K  (hidden comment: Resistor)
R42  value 6K  (hidden comment: Resistor)
R43  value 6K  (hidden comment: Resistor)
R44  value 6K  (hidden comment: Resistor)
R45  value 3.3K  (hidden comment: Resistor)
R46  3296W-1-103_C48997937  (value not drawn)
R47  value 2.7K  (hidden comment: Resistor)
R48  value 6K  (hidden comment: Resistor)
R49  value 6K  (hidden comment: Resistor)
R50  value 5k  (hidden comment: Resistor)
R51  value 1K  (hidden comment: Resistor)
R52  value 20K  (hidden comment: Resistor)
R53  value 500R  (hidden comment: Resistor)
R54  value 1K  (hidden comment: Resistor)
R55  value 1K  (hidden comment: Resistor)
R56  value 6K  (hidden comment: Resistor)
R?#1  value 6K  (hidden comment: Resistor)
R?#2  value 6K  (hidden comment: Resistor)
R?#3  3296W-1-103_C48997937  (value not drawn)
R?#4  3296W-1-103_C48997937  (value not drawn)
R?#5  value 1K  (hidden comment: Resistor)
R?#6  value 20K  (hidden comment: Resistor)
R?#7  value 1K  (hidden comment: Resistor)
R?#8  value 20K  (hidden comment: Resistor)
R?#9  value 5k  (hidden comment: Resistor)
R?#10  value 5k  (hidden comment: Resistor)
R?#11  value 1K  (hidden comment: Resistor)
R?#12  value 1K  (hidden comment: Resistor)
R?#13  value 6K  (hidden comment: Resistor)
R?#14  value 1K  (hidden comment: Resistor)
R?#15  value 1K  (hidden comment: Resistor)
R?#16  value 6K  (hidden comment: Resistor)
R?#17  value 6K  (hidden comment: Resistor)
R?#18  value 6K  (hidden comment: Resistor)
R?#19  value 0.3R  (hidden comment: Resistor)
R?#20  value 200R  (hidden comment: Resistor)
R?#21  value 6K  (hidden comment: Resistor)
R?#22  value 5k  (hidden comment: Resistor)
R?#23  3296W-1-103_C48997937  (value not drawn)
R?#24  value 1K  (hidden comment: Resistor)
R?#25  value 20K  (hidden comment: Resistor)
R?#26  value 5k  (hidden comment: Resistor)
R?#27  value 1K  (hidden comment: Resistor)
R?#28  value 1K  (hidden comment: Resistor)
R?#29  value 6K  (hidden comment: Resistor)
R?#30  value 10K  (hidden comment: Resistor)
R?#31  value 6K  (hidden comment: Resistor)
R?#32  value 100R  (hidden comment: Resistor)
R?#33  value 100R  (hidden comment: Resistor)
R?#34  value 6K  (hidden comment: Resistor)
R?#35  value 6K  (hidden comment: Resistor)
R?#36  value 6K  (hidden comment: Resistor)
R?#37  value 6K  (hidden comment: Resistor)
R?#38  value 240R  (hidden comment: Resistor)
R?#39  value 240R  (hidden comment: Resistor)
R?#40  value 0.5R  (hidden comment: Resistor)
R?#41  value 0.3R  (hidden comment: Resistor)
R?#42  value 200R  (hidden comment: Resistor)
R?#43  value 0.3R  (hidden comment: Resistor)
R?#44  value 200R  (hidden comment: Resistor)
R?#45  value 3.3K  (hidden comment: Resistor)
R?#46  value 3.3K  (hidden comment: Resistor)
R?#47  3296W-1-103_C48997937  (value not drawn)
R?#48  3296W-1-103_C48997937  (value not drawn)
R?#49  value 10K  (hidden comment: Resistor)
R?#50  value 2.7K  (hidden comment: Resistor)
R?#51  value 6K  (hidden comment: Resistor)
R?#52  value 2.7K  (hidden comment: Resistor)
R?#53  value 6K  (hidden comment: Resistor)
R?#54  value 6K  (hidden comment: Resistor)
R?#55  value 6K  (hidden comment: Resistor)
R?#56  value 5k  (hidden comment: Resistor)
R?#57  value 5k  (hidden comment: Resistor)
R?#58  value 20K  (hidden comment: Resistor)
R?#59  value 1K  (hidden comment: Resistor)
R?#60  value 20K  (hidden comment: Resistor)
R?#61  value 1K  (hidden comment: Resistor)
R?#62  value 240R  (hidden comment: Resistor)
R?#63  value 500R  (hidden comment: Resistor)
R?#64  value 500R  (hidden comment: Resistor)
R?#65  value 0.3R  (hidden comment: Resistor)
R?#66  value 1K  (hidden comment: Resistor)
R?#67  value 1K  (hidden comment: Resistor)
R?#68  value 1K  (hidden comment: Resistor)
R?#69  value 1K  (hidden comment: Resistor)
R?#70  value 6K  (hidden comment: Resistor)
R?#71  value 6K  (hidden comment: Resistor)
R?#72  value 10K  (hidden comment: Resistor)
R?#73  value 100R  (hidden comment: Resistor)
R?#74  value 100R  (hidden comment: Resistor)
R?#75  value 6K  (hidden comment: Resistor)
R?#76  value 6K  (hidden comment: Resistor)
R?#77  value 240R  (hidden comment: Resistor)
R?#78  value 0.3R  (hidden comment: Resistor)
R?#79  value 200R  (hidden comment: Resistor)
R?#80  value 3.3K  (hidden comment: Resistor)
R?#81  3296W-1-103_C48997937  (value not drawn)
R?#82  value 2.7K  (hidden comment: Resistor)
R?#83  value 6K  (hidden comment: Resistor)
R?#84  value 6K  (hidden comment: Resistor)
R?#85  value 5k  (hidden comment: Resistor)
R?#86  value 20K  (hidden comment: Resistor)
R?#87  value 1K  (hidden comment: Resistor)
R?#88  value 500R  (hidden comment: Resistor)
R?#89  value 1K  (hidden comment: Resistor)
R?#90  value 1K  (hidden comment: Resistor)
R?#91  value 6K  (hidden comment: Resistor)
R?#92  value 10K  (hidden comment: Resistor)
R?#93  value 100R  (hidden comment: Resistor)
R?#94  value 100R  (hidden comment: Resistor)
R?#95  value 6K  (hidden comment: Resistor)
R?#96  value 6K  (hidden comment: Resistor)
R?#97  value 240R  (hidden comment: Resistor)
R?#98  value 0.3R  (hidden comment: Resistor)
R?#99  value 3.3K  (hidden comment: Resistor)
R?#100  value 200R  (hidden comment: Resistor)
R?#101  value 6K  (hidden comment: Resistor)
R?#102  3296W-1-103_C48997937  (value not drawn)
R?#103  3296W-1-103_C48997937  (value not drawn)
R?#104  value 1K  (hidden comment: Resistor)
R?#105  value 20K  (hidden comment: Resistor)
R?#106  value 2.7K  (hidden comment: Resistor)
R?#107  value 6K  (hidden comment: Resistor)
R?#108  value 6K  (hidden comment: Resistor)
R?#109  value 5k  (hidden comment: Resistor)
R?#110  value 5k  (hidden comment: Resistor)
R?#111  value 1K  (hidden comment: Resistor)
R?#112  value 20K  (hidden comment: Resistor)
R?#113  value 1K  (hidden comment: Resistor)
R?#114  value 1K  (hidden comment: Resistor)
R?#115  value 6K  (hidden comment: Resistor)
R?#116  value 500R  (hidden comment: Resistor)
R?#117  value 1K  (hidden comment: Resistor)
R?#118  value 1K  (hidden comment: Resistor)
R?#119  value 6K  (hidden comment: Resistor)

## Blocks framed on the sheet
带隙基准: Q20 Q21 R11-R13
达林顿电流源: Q19 Q22 R14
带隙基准（优化）: Q24 Q27 R19
Vref: Q23 Q25 Q26 R15-R18
启动电压: D1 Q44 Q47 R38-R41
电源供电: Q43 Q45 Q46 R37 R?#18
12、过温保护: Q52 Q54 Q55 Q?#17 Q?#19 Q?#21 R46 R48-R50 R?#19 R?#20
启动电压: D2 Q50 Q53 R43-R45 R47 R53
电源供电: Q48 Q49 Q51 R42 R?#17
5V: R?#23 R?#26
带隙基准: Q38-Q42 R32-R36
过温保护: Q56
带隙基准: Q57-Q61 R51 R52 R54-R56
启动电压: D?#2 Q?#37 Q?#46 R?#34 R?#35 R?#45 R?#50 R?#63
电源供电: Q?#32 Q?#33 Q?#44 R?#31
12、过压保护: D?#1 D?#4 Q?#43 Q?#48 Q?#51 Q?#53 Q?#56 R?#30 R?#47 R?#49 R?#53 R?#55 R?#57 R?#62 R?#65
启动电压: D?#3 Q?#38 Q?#47 R?#36 R?#37 R?#46 R?#52 R?#64
电源供电: Q?#30 Q?#31 Q?#45 R?#32 R?#33
功率三极管: Q?#34 Q?#39 R?#39 R?#41 R?#44
带隙基准: Q?#57 Q?#60-Q?#62 Q?#65 R?#59 R?#60 R?#67 R?#68 R?#70
带隙基准: Q?#58 Q?#59 Q?#63 Q?#64 Q?#66 R?#58 R?#61 R?#66 R?#69 R?#71
过温保护: Q?#54
过温保护: Q?#55
13、PCB布局: D?#5 Q?#72 Q?#75-Q?#77 R?#72 R?#81 R?#83-R?#85
启动电压: D?#6 Q?#70 Q?#74 R?#75 R?#76 R?#80 R?#82 R?#88
镜像电流源: Q?#67 Q?#68 Q?#73 R?#73 R?#74
功率三极管: Q?#69 Q?#71 R?#77-R?#79
过温保护: Q?#78
带隙基准: Q?#79-Q?#83 R?#86 R?#87 R?#89-R?#91

## Nets
+VCC: Q16.1(C) Q23.1(C) Q?#5.3(E) Q?#6.3(E) Q?#8.1(C) Q?#10.1(C) Q?#22.3(E) Q?#25.1(C) R8.2 R9.2 R11.2 R12.2 R15.2 R16.2 R?#1.1 R?#2.1 R?#5.2 R?#6.2 R?#7.2 R?#8.2 R?#21.1 R?#24.2 R?#25.2
GND: D1.1(A) D2.1(A) D?#2.1(A) D?#3.1(A) D?#6.1(A) D?#8.1(A) Q16.3(E) Q18.3(E) Q21.3(E) Q22.3(E) Q26.3(E) Q27.3(E) Q37.1(C) Q41.3(E) Q42.3(E) Q55.1(C) Q56.3(E) Q60.3(E) Q61.3(E) Q?#11.3(E) Q?#13.3(E) Q?#14.3(E) Q?#16.3(E) Q?#23.1(C) Q?#26.3(E) Q?#28.3(E) Q?#52.1(C) Q?#53.1(C) Q?#54.3(E) Q?#55.3(E) Q?#61.3(E) Q?#63.3(E) Q?#65.3(E) Q?#66.3(E) Q?#77.1(C) Q?#78.3(E) Q?#81.3(E) Q?#83.3(E) Q?#97.1(C) Q?#98.3(E) Q?#100.3(E) Q?#101.3(E) Q?#104.3(E) Q?#106.3(E) R10.1 R13.1 R14.1 R17.1 R18.1 R19.1 R31.1 R34.1 R35.1 R36.1 R41.1 R50.1 R53.1 R54.1 R55.1 R56.1 R?#9.1 R?#10.1 R?#11.1 R?#12.1 R?#13.1 R?#14.1 R?#15.1 R?#16.1 R?#26.1 R?#27.1 R?#28.1 R?#29.1 R?#56.1 R?#57.1 R?#63.1 R?#64.1 R?#66.1 R?#67.1 R?#68.1 R?#69.1 R?#70.1 R?#71.1 R?#85.1 R?#88.1 R?#89.1 R?#90.1 R?#91.1 R?#109.1 R?#110.1 R?#113.1 R?#114.1 R?#115.1 R?#116.1 R?#117.1 R?#118.1 R?#119.1
VCC: Q49.3(E) Q?#17.1(C) Q?#19.1(C) Q?#29.1(C) Q?#33.3(E) Q?#34.1(C) Q?#35.1(C) Q?#36.1(C) Q?#39.1(C) Q?#40.1(C) Q?#69.1(C) Q?#71.1(C) Q?#84.1(C) Q?#86.1(C) R37.2 R38.2 R39.2 R42.2 R43.2 R44.2 R?#17.2 R?#18.2 R?#30.1 R?#31.2 R?#32.2 R?#33.2 R?#34.2 R?#35.2 R?#36.2 R?#37.2 R?#49.1 R?#72.1 R?#73.2 R?#74.2 R?#75.2 R?#76.2 R?#92.1 R?#93.2 R?#94.2 R?#95.2 R?#96.2
VOUT: Q?#1.3(E) Q?#2.1(C) Q?#3.3(E) Q?#4.1(C) Q?#5.1(C) Q?#6.1(C) Q?#18.3(E) Q?#20.1(C) Q?#22.1(C) Q?#87.3(E) Q?#88.1(C) Q?#90.1(C) R?#3.2 R?#3.3 R?#4.2 R?#4.3 R?#23.2 R?#23.3 R?#65.1 R?#103.2 R?#103.3
VIN: E?#1.2 E?#2.2 E?#3.2 E?#4.2 Q?#1.1(C) Q?#3.1(C) Q?#18.1(C) Q?#87.1(C)
NetD1_2: D1.2(K) Q44.2(B) R38.1
NetD2_2: D2.2(K) Q50.2(B) R43.1
NetD?#1_1: D?#1.1(A) Q?#43.2(B) R?#39.2
NetD?#1_2: D?#1.2(K) R?#30.2
NetD?#2_2: D?#2.2(K) Q?#37.2(B) R?#34.1
NetD?#3_2: D?#3.2(K) Q?#38.2(B) R?#36.1
NetD?#4_1: D?#4.1(A) Q?#56.2(B) R?#62.1
NetD?#4_2: D?#4.2(K) R?#49.2
NetD?#5_1: D?#5.1(A) Q?#72.2(B) R?#77.2
NetD?#5_2: D?#5.2(K) R?#72.2
NetD?#6_2: D?#6.2(K) Q?#70.2(B) R?#75.1
NetD?#7_1: D?#7.1(A) Q?#89.2(B) R?#97.2
NetD?#7_2: D?#7.2(K) R?#92.2
NetD?#8_2: D?#8.2(K) Q?#85.2(B) R?#95.1
NetE?#1_1: E?#1.1 Q?#1.2(B) Q?#7.1(C) Q?#13.1(C)
NetE?#2_1: E?#2.1 Q?#3.2(B) Q?#9.1(C) Q?#16.1(C)
NetE?#3_1: E?#3.1 Q?#18.2(B) Q?#23.3(E) R?#22.2
NetE?#4_1: E?#4.1 Q?#87.2(B) Q?#94.1(C) Q?#100.1(C)
NetQ1_1: Q1.1(C) Q1.2(B) Q2.2(B) Q?#91.1(C) Q?#92.1(C)
NetQ1_3: Q1.3(E) R?#94.1
NetQ2_1: Q2.1(C) Q?#84.2(B) Q?#89.1(C) Q?#97.3(E) Q?#101.1(C) R?#107.2
NetQ2_3: Q2.3(E) R?#93.1
NetQ16_2: Q16.2(B) Q17.1(C) R8.1
NetQ17_2: Q17.2(B) Q18.1(C) Q18.2(B) R9.1
NetQ17_3: Q17.3(E) R10.2
NetQ19_1: Q19.1(C) Q22.1(C)
NetQ19_2: Q19.2(B) Q20.1(C) R11.1
NetQ19_3: Q19.3(E) Q22.2(B) R14.2
NetQ20_2: Q20.2(B) Q21.1(C) Q21.2(B) R12.1
NetQ20_3: Q20.3(E) R13.2
NetQ23_2: Q23.2(B) Q26.1(C) R15.1
NetQ23_3: Q23.3(E) Q25.2(B) Q26.2(B) R17.2
NetQ24_1: Q24.1(C) Q27.1(C)
NetQ24_2: Q24.2(B) Q25.1(C) R16.1
NetQ24_3: Q24.3(E) Q27.2(B) R19.2
NetQ25_3: Q25.3(E) R18.2
NetQ35_1: Q35.1(C) Q46.2(B) R28.3
NetQ35_2: Q35.2(B) R28.1 R28.2 R31.2
NetQ35_3: Q35.3(E) Q36.2(B) R30.2
NetQ36_1: Q36.1(C) Q46.3(E)
NetQ36_3: Q36.3(E) Q38.1(C) Q47.3(E) R30.1 R32.2 R33.2
NetQ37_2: Q37.2(B) Q39.1(C) Q42.1(C) R29.1
NetQ37_3: Q37.3(E) Q45.1(C) R29.2
NetQ38_2: Q38.2(B) Q41.1(C) R32.1
NetQ38_3: Q38.3(E) Q40.2(B) Q41.2(B) R34.2
NetQ39_2: Q39.2(B) Q40.1(C) R33.1
NetQ39_3: Q39.3(E) Q42.2(B) R36.2
NetQ40_3: Q40.3(E) R35.2
NetQ43_1: Q43.1(C) Q43.2(B) Q45.2(B) Q46.1(C) Q47.1(C)
NetQ43_3: Q43.3(E) R37.1
NetQ44_1: Q44.1(C) R39.1
NetQ44_3: Q44.3(E) R40.2
NetQ45_3: Q45.3(E) R?#18.1
NetQ47_2: Q47.2(B) R40.1 R41.2
NetQ48_1: Q48.1(C) Q48.2(B) Q49.2(B) Q51.1(C) Q53.1(C)
NetQ48_3: Q48.3(E) R42.1
NetQ49_1: Q49.1(C) Q55.3(E) Q56.1(C) Q?#17.2(B) Q?#21.1(C) R48.2
NetQ50_1: Q50.1(C) R44.1
NetQ50_3: Q50.3(E) R45.2
NetQ51_2: Q51.2(B) Q52.1(C) Q?#21.3(E) R46.3 R?#19.1 R?#20.1
NetQ51_3: Q51.3(E) Q54.1(C)
NetQ52_2: Q52.2(B) R46.1 R46.2 R50.2
NetQ52_3: Q52.3(E) Q54.2(B) R49.2
NetQ53_2: Q53.2(B) R45.1 R47.2
NetQ53_3: Q53.3(E) Q54.3(E) Q57.1(C) R49.1 R51.2 R52.2
NetQ55_2: Q55.2(B) Q58.1(C) Q61.1(C) R48.1
NetQ56_2: Q56.2(B) R47.1 R53.2
NetQ57_2: Q57.2(B) Q60.1(C) R51.1
NetQ57_3: Q57.3(E) Q59.2(B) Q60.2(B) R54.2
NetQ58_2: Q58.2(B) Q59.1(C) R52.1
NetQ58_3: Q58.3(E) Q61.2(B) R56.2
NetQ59_3: Q59.3(E) R55.2
NetQ?#2_2: Q?#2.2(B) R?#3.1 R?#9.2
NetQ?#2_3: Q?#2.3(E) Q?#5.2(B) R?#1.2
NetQ?#4_2: Q?#4.2(B) R?#4.1 R?#10.2
NetQ?#4_3: Q?#4.3(E) Q?#6.2(B) R?#2.2
NetQ?#7_2: Q?#7.2(B) Q?#12.1(C) R?#6.1
NetQ?#7_3: Q?#7.3(E) Q?#13.2(B) R?#13.2
NetQ?#8_2: Q?#8.2(B) Q?#11.1(C) R?#5.1
NetQ?#8_3: Q?#8.3(E) Q?#11.2(B) Q?#12.2(B) R?#11.2
NetQ?#9_2: Q?#9.2(B) Q?#15.1(C) R?#8.1
NetQ?#9_3: Q?#9.3(E) Q?#16.2(B) R?#16.2
NetQ?#10_2: Q?#10.2(B) Q?#14.1(C) R?#7.1
NetQ?#10_3: Q?#10.3(E) Q?#14.2(B) Q?#15.2(B) R?#14.2
NetQ?#12_3: Q?#12.3(E) R?#12.2
NetQ?#15_3: Q?#15.3(E) R?#15.2
NetQ?#17_3: Q?#17.3(E) Q?#19.2(B) R?#20.2
NetQ?#19_3: Q?#19.3(E) Q?#21.2(B) R?#19.2
NetQ?#20_2: Q?#20.2(B) R?#23.1 R?#26.2
NetQ?#20_3: Q?#20.3(E) Q?#22.2(B) R?#21.2
NetQ?#23_2: Q?#23.2(B) Q?#24.1(C) Q?#28.1(C) R?#22.1
NetQ?#24_2: Q?#24.2(B) Q?#27.1(C) R?#25.1
NetQ?#24_3: Q?#24.3(E) Q?#28.2(B) R?#29.2
NetQ?#25_2: Q?#25.2(B) Q?#26.1(C) R?#24.1
NetQ?#25_3: Q?#25.3(E) Q?#26.2(B) Q?#27.2(B) R?#27.2
NetQ?#27_3: Q?#27.3(E) R?#28.2
NetQ?#29_2: Q?#29.2(B) Q?#41.1(C)
NetQ?#29_3: Q?#29.3(E) Q?#36.2(B)
NetQ?#30_1: Q?#30.1(C) Q?#30.2(B) Q?#31.2(B) Q?#45.1(C) Q?#47.1(C)
NetQ?#30_3: Q?#30.3(E) R?#32.1
NetQ?#31_1: Q?#31.1(C) Q?#34.2(B) Q?#43.1(C) Q?#53.3(E) Q?#55.1(C) R?#53.2
NetQ?#31_3: Q?#31.3(E) R?#33.1
NetQ?#32_1: Q?#32.1(C) Q?#32.2(B) Q?#33.2(B) Q?#44.1(C) Q?#46.1(C)
NetQ?#32_3: Q?#32.3(E) R?#31.1
NetQ?#33_1: Q?#33.1(C) Q?#35.2(B) Q?#42.1(C) Q?#52.3(E) Q?#54.1(C) R?#51.2
NetQ?#34_3: Q?#34.3(E) Q?#39.2(B) R?#44.2
NetQ?#35_3: Q?#35.3(E) Q?#40.2(B) R?#42.2
NetQ?#36_3: Q?#36.3(E) Q?#41.2(B) R?#40.2
NetQ?#37_1: Q?#37.1(C) R?#35.1
NetQ?#37_3: Q?#37.3(E) R?#45.2
NetQ?#38_1: Q?#38.1(C) R?#37.1
NetQ?#38_3: Q?#38.3(E) R?#46.2
NetQ?#39_3: Q?#39.3(E) R?#39.1 R?#41.2
NetQ?#40_3: Q?#40.3(E) R?#38.1 R?#43.2
NetQ?#41_3: Q?#41.3(E) R?#40.1
NetQ?#42_2: Q?#42.2(B) R?#38.2
NetQ?#42_3: Q?#42.3(E) Q?#44.2(B) Q?#49.1(C) R?#42.1 R?#43.1 R?#48.3
NetQ?#43_3: Q?#43.3(E) Q?#45.2(B) Q?#48.1(C) R?#41.1 R?#44.1 R?#47.3
NetQ?#44_3: Q?#44.3(E) Q?#50.1(C)
NetQ?#45_3: Q?#45.3(E) Q?#51.1(C)
NetQ?#46_2: Q?#46.2(B) R?#45.1 R?#50.2
NetQ?#46_3: Q?#46.3(E) Q?#50.3(E) Q?#60.1(C) R?#54.1 R?#59.2 R?#60.2
NetQ?#47_2: Q?#47.2(B) R?#46.1 R?#52.2
NetQ?#47_3: Q?#47.3(E) Q?#51.3(E) Q?#58.1(C) R?#55.1 R?#58.2 R?#61.2
NetQ?#48_2: Q?#48.2(B) R?#47.1 R?#47.2 R?#57.2
NetQ?#48_3: Q?#48.3(E) Q?#51.2(B) R?#55.2
NetQ?#49_2: Q?#49.2(B) R?#48.1 R?#48.2 R?#56.2
NetQ?#49_3: Q?#49.3(E) Q?#50.2(B) R?#54.2
NetQ?#52_2: Q?#52.2(B) Q?#57.1(C) Q?#65.1(C) R?#51.1
NetQ?#53_2: Q?#53.2(B) Q?#59.1(C) Q?#66.1(C) R?#53.1
NetQ?#54_2: Q?#54.2(B) R?#50.1 R?#63.2
NetQ?#55_2: Q?#55.2(B) R?#52.1 R?#64.2
NetQ?#57_2: Q?#57.2(B) Q?#62.1(C) R?#60.1
NetQ?#57_3: Q?#57.3(E) Q?#65.2(B) R?#70.2
NetQ?#58_2: Q?#58.2(B) Q?#63.1(C) R?#61.1
NetQ?#58_3: Q?#58.3(E) Q?#63.2(B) Q?#64.2(B) R?#66.2
NetQ?#59_2: Q?#59.2(B) Q?#64.1(C) R?#58.1
NetQ?#59_3: Q?#59.3(E) Q?#66.2(B) R?#71.2
NetQ?#60_2: Q?#60.2(B) Q?#61.1(C) R?#59.1
NetQ?#60_3: Q?#60.3(E) Q?#61.2(B) Q?#62.2(B) R?#67.2
NetQ?#62_3: Q?#62.3(E) R?#68.2
NetQ?#64_3: Q?#64.3(E) R?#69.2
NetQ?#67_1: Q?#67.1(C) Q?#67.2(B) Q?#68.2(B) Q?#73.1(C) Q?#74.1(C)
NetQ?#67_3: Q?#67.3(E) R?#73.1
NetQ?#68_1: Q?#68.1(C) Q?#69.2(B) Q?#72.1(C) Q?#77.3(E) Q?#78.1(C) R?#83.2
NetQ?#68_3: Q?#68.3(E) R?#74.1
NetQ?#69_3: Q?#69.3(E) Q?#71.2(B) R?#79.2
NetQ?#70_1: Q?#70.1(C) R?#76.1
NetQ?#70_3: Q?#70.3(E) R?#80.2
NetQ?#71_3: Q?#71.3(E) R?#77.1 R?#78.2
NetQ?#72_3: Q?#72.3(E) Q?#73.2(B) Q?#75.1(C) R?#78.1 R?#79.1 R?#81.3
NetQ?#73_3: Q?#73.3(E) Q?#76.1(C)
NetQ?#74_2: Q?#74.2(B) R?#80.1 R?#82.2
NetQ?#74_3: Q?#74.3(E) Q?#76.3(E) Q?#79.1(C) R?#84.1 R?#86.2 R?#87.2
NetQ?#75_2: Q?#75.2(B) R?#81.1 R?#81.2 R?#85.2
NetQ?#75_3: Q?#75.3(E) Q?#76.2(B) R?#84.2
NetQ?#77_2: Q?#77.2(B) Q?#80.1(C) Q?#83.1(C) R?#83.1
NetQ?#78_2: Q?#78.2(B) R?#82.1 R?#88.2
NetQ?#79_2: Q?#79.2(B) Q?#81.1(C) R?#87.1
NetQ?#79_3: Q?#79.3(E) Q?#81.2(B) Q?#82.2(B) R?#89.2
NetQ?#80_2: Q?#80.2(B) Q?#82.1(C) R?#86.1
NetQ?#80_3: Q?#80.3(E) Q?#83.2(B) R?#91.2
NetQ?#82_3: Q?#82.3(E) R?#90.2
NetQ?#84_3: Q?#84.3(E) Q?#86.2(B) R?#100.2
NetQ?#85_1: Q?#85.1(C) R?#96.1
NetQ?#85_3: Q?#85.3(E) R?#99.2
NetQ?#86_3: Q?#86.3(E) R?#97.1 R?#98.2
NetQ?#88_2: Q?#88.2(B) R?#103.1 R?#109.2
NetQ?#88_3: Q?#88.3(E) Q?#90.2(B) R?#101.2
NetQ?#89_3: Q?#89.3(E) Q?#91.2(B) Q?#93.1(C) R?#98.1 R?#100.1 R?#102.3
NetQ?#90_3: Q?#90.3(E) Q?#96.1(C) R?#101.1 R?#104.2 R?#105.2
NetQ?#91_3: Q?#91.3(E) Q?#95.1(C)
NetQ?#92_2: Q?#92.2(B) R?#99.1 R?#106.2
NetQ?#92_3: Q?#92.3(E) Q?#95.3(E) Q?#103.1(C) R?#108.1 R?#111.2 R?#112.2
NetQ?#93_2: Q?#93.2(B) R?#102.1 R?#102.2 R?#110.2
NetQ?#93_3: Q?#93.3(E) Q?#95.2(B) R?#108.2
NetQ?#94_2: Q?#94.2(B) Q?#99.1(C) R?#105.1
NetQ?#94_3: Q?#94.3(E) Q?#100.2(B) R?#115.2
NetQ?#96_2: Q?#96.2(B) Q?#98.1(C) R?#104.1
NetQ?#96_3: Q?#96.3(E) Q?#98.2(B) Q?#99.2(B) R?#113.2
NetQ?#97_2: Q?#97.2(B) Q?#102.1(C) Q?#106.1(C) R?#107.1
NetQ?#99_3: Q?#99.3(E) R?#114.2
NetQ?#101_2: Q?#101.2(B) R?#106.1 R?#116.2
NetQ?#102_2: Q?#102.2(B) Q?#105.1(C) R?#112.1
NetQ?#102_3: Q?#102.3(E) Q?#106.2(B) R?#119.2
NetQ?#103_2: Q?#103.2(B) Q?#104.1(C) R?#111.1
NetQ?#103_3: Q?#103.3(E) Q?#104.2(B) Q?#105.2(B) R?#117.2
NetQ?#105_3: Q?#105.3(E) R?#118.2
NetR?#62_2: R?#62.2 R?#65.2

Not connected (* = marked no-connect by the designer): Q?#56 1(C) 3(E); R?#17 1

## Notes on the sheet
- 带隙基准
- 恒定带隙基准
- Vref
- Vref = n* ∆Vbe + Vbe
- (near R9) Ir
- (near R8) Ie2
- (near R8) 10*∆Vbe
- 正温度系数
- 负温度系数
- 1.2V
- Ube17
- (near R12) Ir
- (near R11) Ie2
- (near R11) 20*∆Vbe
- Ic4
- Ie1
- Vbeq3
- (near Q16) Vref = Vbeq3 + Vbe
  Vref = 10* ∆Vbe + Vbe
  ∆Vbe是正温度变化
  Vbe是负温度变化
- Ube18
- ∆Vbe
- (near Q19) Ic2
- (near Q22) Ic3
- (near Q18) Vbeq1
- (near Q18) Ib1
- (near Q17) Ib2
- (near Q17) Vbeq2
- (near Q21) Vbeq1
- (near Q21) Ib1
- (near Q20) Ib2
- (near Q20) Vbeq2
- 为什么选择20K？为什么不使用10K？
  因为后级有Q19和Q22
  为什么使用威尔逊电流源？不像前面电路只使用一个三级管Q19？
  克服普通电流镜的“基极电流损耗”，减小流入Q19的电流。
  负载Ic4电流变大后，由Ic2和Ic3可以进行分流，从而Q19基极电流相对减小
- Ic0
- (near R10) Ic1
- 0
- be结电压与温度的关系
- 300°K
  （room temperature）
- (near R13) Ic1
- Vref的电压就等于Vbeq3+R13两端的电压
  因为7805内部Q3是两个三极管所以压降是两个Vbe
  所以R2是VR11=20*△Vbe
- (near Q16) 门隙电压基准的思路，用一个正温度系数的电压去补偿PN结的负温度系数我们用的随温度增加的电压是他的热电压VT-kT/q
  VT的温度系数很小是0.085mV/C*23=2mV
- 由微电流源结构可以知道Ic1电流来着：
  Ube17 - Ube18
  Ic1 = ——————
  Re10
  也就是在R10上的压降，我们设为∆Vbe，∆Vbe一般为70mv
  ∆Vbe是正温度系数：
  假设温度上升——》三极管Vbe降低，Ib2上升，Ic1会上升——》∆Vbe会上升
  我们先忽略Q16对Ie2的电流影响，考虑Ie2和Ic1的关系。
  由于共用一个三级管，Ie2和Ic1电流相同，所以参数电压成倍数关系：
  Vr8 = 10 *∆Vbe = 0.7V
  我们把△Vbe这个误差通过这两个电阻进行了放大
  △Vbe0.07V，一个Vbe是0.7V是他的10倍
  PN结在同样温度变化的情况下Vbe=10*∆Vbe
  我应该把R2改成10K那么此时一个正温度系数与负温度系数相抵消就不随温度变化了
- 反馈：温度系数变化反馈
- 反馈：输出电压过高反馈
- (near R15) Ie1
- Ie2
- (near Q24) Ic2
- (near Q27) Ic3
- 在Q25和Q26管的基极与地之间加电阻R17
  ，从而增大Q23管的静态工作电流
- 加射极输出器的电流源电路，利用Q13管的电流放大作用减小了基极电流IB1和IB2对基准电流IR的分流
  加射极输出器之后，并不会改变镜像电流源中Ic1和ICo的镜像关系
- VIN
- (near Q26) Ib1
- Ib2
- (near Q25) Ic1
- 当Q25截止的话也会有漏电流
  如果没有R19电阻这个漏电流会成为Q3的基极电流，如果参与了放大过程误差就不对了R19应该是吸收漏电流的
- (near Q?#4) Vbe
- (near Q?#2) Vbe
- (near Q?#6) Vbe
- (near R?#2) Vref
- error out
- (near Q?#5) Vbe
- (near R?#1) Vref
- Q19和Q22形成了误差放大器：
  当R11上电压变大，Ie2电流变大，导致流过Q19和Q22的电流变大，从而Ic4电流变大，通过Ic4的电流值进行外界控制
- (near R?#7) Ie1
- (near R?#8) 20△Vbe
- (near R?#5) Ie1
- (near R?#6) 20△Vbe
- (near Q?#10) Ie2
- (near Q?#15) Ic1
- (near Q?#9) Vbe
- (near Q?#9) Ic2
- (near Q?#16) Ic3
- (near R?#4) 5V
- (near Q?#8) Ie2
- (near Q?#12) Ic1
- (near Q?#7) Vbe
- (near Q?#7) Ic2
- (near Q?#13) Ic3
- (near R?#3) 5V
- △Vbe
- (near Q?#14) Ib1
- (near Q?#16) Vbe
- (near Q?#11) Ib1
- (near Q?#13) Vbe
- 要找到该电路的温度补偿稳定电压，从地面方向上跟着紫色箭头向上移动
- 因此，该电路的稳定点是5V。在此电压下，误差放大晶体管会处于有源区，并对任何偏离该区域的波动做出响应
- 电压加起来为4Vbe+20ΔVBE，由于有四个VBE，电路必须设计为带隙电压的四倍，约为5V
- 反馈路径分析：
  假设输出电压5V上升——》Q28和Q29的集电极电压上升 +R20上分得电流增加——》Q28上基极电流增加——》Q28发射极电流上升（Ic2）+  Q29的基极电流上升 ——》由于基准电压不会发生变化以及Q33和Q32形成恒等电流源，Ic1不会发生改变，多余产生的电流将通过Ib3流向误差放大器输出（Ib3 = Ic4 - Ic1 = Ic3 + Ic2 - Ic1）——》从而导致Ic2的电流增大---Ic3的电流增大
- 11、添加电源+启动电路
- 误差放大输入：
  作为误差放大器的输出，引入负反馈调整系统稳定
- 提高反馈的输出电流
- 达林顿输出
- Q39有两个作用一个是作为缓冲器，做一个阻抗变换，输入阻抗很大输出阻抗很小误差放大器既是基准源的一部分又是误差放大器所以说他的噪声是同一个噪声
- (near Q?#19) 功率三极管
- (near Q?#20) Vbe
- (near Q?#22) Vbe
- (near R?#21) Vref
- (near R?#22) error out
- (near R28) 5v
- 过流保护
- (near R?#19) 5v
- (near R?#25) 20△Vbe
- (near R?#22) Ic4
- (near Q46) 误差放大输入
- 初始上电时， 电流镜不能给下级供电
- 所以需要加上启动电路
- (near Q51) 误差放大输入
- 过温饱和的三极管紧贴着输出功率三级管，如果功率三极管温度升高，将导致过温保护的三极管Vbe压降下降，从而导致三极管导通
- (near R?#24) Ie1
- (near Q?#25) Ie2
- (near Q?#24) Vbe
- (near Q?#24) Ic2
- (near Q?#28) Ic3
- (near Q36) Ic3
- Ic2
- Vbeq1
- 通过电阻分压将Q47三极管打开
- 可以将三极管Q47的基极电压设置在Vref-0.4V
- (near Q54) Ic3
- (near Q?#26) Ib1
- (near Q?#27) Ic1
- (near Q?#28) Vbe
- (near R32) Ir
- (near R30) Vbeq2
- 基准电压2.047V
- 误差放大输出
- (near Q37) Ic4
- 这样当基准电压开始工作时，Q47导通压降不够，自动关闭
- 为什么后级电路不能正常工作呢
- 主要是Q46三极管没有导通
- (near R51) Ir
- (near R49) Vbeq2
- (near Q55) Ic4
- 缺点：由于三级管由截止状态转换为放大状态，最终才变成饱和状态，如果处于放大状态，则三级管等效为可变电阻，则不会马上导致LDO关断
- (near R32) Ie1
- (near R33) Ic4
- (near R33) Vbeq3
- Ib3
- 基准电压不能先工作起来
- Q46三极管起到电源和基准电压隔离的作用
- (near R51) Ie1
- (near R52) Ic4
- (near R52) Vbeq3
- (near Q58) Ic2
- (near Q61) Ic3
- 电流放电的作用：
- (near Q41) Ib1
- (near Q39) Ic2
- (near Q42) Ic3
- (near Q60) Ib1
- Ic1
- 让电流镜输出电流增大，上面达林顿输出电流增大，让调整效果更好
- 减小流入后级达林顿的电流
- 三极管处于放大状态，当误差电流变大后，三极管的等效电阻减小
- (near Q41) Ic0
- (near Q60) Ic0
- 12、过流保护
- 4-SOA保护(安全工作区)
- (near Q?#36) 达林顿驱动
- 过压保护
- (near Q?#40) 功率三极管
- 安全区保护是为了防止二次击穿的
  因为我们主要的功率都是通过Q17这个三极管产生的在同样功率的情况下
  50V*1A-50W 高压下会更危险10V*5A=50W
  我们Q17三极管两端的最大压差是35V-5V-30V
  压降这么高的情况下他两端允许通过的电流就不能那么大了就要往小里减就做不到输出的恒功率了
- (near Q?#41) 过流保护
- (near R?#40) 电流采样电阻
- (near R?#40) 5v
- (near R?#43) 5v
- (near R?#43) 电流采样电阻
- (near Q?#43) 过流保护
- (near R?#41) 5v
- (near Q?#44) 误差放大输入
- (near Q?#45) 误差放大输入
- (near Q?#50) Ic3
- (near Q?#51) Ic3
- (near R?#59) Ir
- (near R?#54) Vbeq2
- (near R?#60) 基准电压2.047V
- (near Q?#52) Ic4
- 缺点：由于三级管由截止状态转换为放大状态，最终才变成饱和状态，如果处于放大状态，则三级管等效为可变电阻，则不会马上导致LDO关断,和温度保护一样的缺点
- (near R?#61) Ir
- (near R?#55) Vbeq2
- (near R?#58) 基准电压2.047V
- (near Q?#53) Ic4
- (near R?#59) Ie1
- (near R?#60) Ic4
- (near R?#60) Vbeq3
- (near Q?#62) Ib3
- (near Q?#57) Ic2
- (near Q?#65) Ic3
- (near R?#61) Ie1
- (near R?#58) Ic4
- (near R?#58) Vbeq3
- (near Q?#64) Ib3
- (near Q?#59) Ic2
- (near Q?#66) Ic3
- (near Q?#56) 既有输入电流采样电流的控制我还跟Vin与Vout的压差相关
  如果R13与R12直接分压就是一个线性比例关系
  如果我输入电压与输出电压差1V我也有一个小的输出
  压差比较低的时候我允许通过的电流大一些
  这里我们还需要考虑压差(Vin-Vout)要有一个起控点
  相当于在控制上加一个判断条件，当电压高于多少的时候我才开让你的电流往下降
- (near Q?#61) Ib1
- (near Q?#60) Ie2
- (near Q?#63) Ib1
- (near Q?#58) Ie2
- (near Q?#61) Ic0
- (near Q?#63) Ic0
- (near Q?#56) 当Vin-Vout的压差低于8V的时候稳压管是不工作的
  此时Q3三极管b极这个电压只取决于检流电阻上的电流
  此时Q3的导通条件就变成了Vin-8V然后再和电阻分压
  此时起控点就变了，随着压差增加流过检流电阻所需要的电流值小一点也能保护稳压管实现了分段控制，电压差高于8V的时候Q3的基极电压才开始增加
  输入输出电压差高于8V的时候我才让你电流往下降
  这个稳压管在这里面就实现了一个分段函数(分段控制)把线性控制改成了非线性控制
  Vin-Vout超过8V稳压管导通，剩余电压经过R5与R3和R1分压给Q3的基极提供偏置电压进而降低了检流电阻上的过流值
- 我们可以按照走线频率以及阻抗进行分类:
  优先级1∶高频低内阻
  优先级2∶高频高内阻
  优先级3∶低频高内阻
  优先级4∶低频低内阻
- 优先级1：
- 优先级2：
- 优先级3：
- 高频高内阻
- 高频低内阻
- 低频高内阻
- 启动电压
- 误差放大输入
- 过温保护
- (near Q?#72) 过流保护
- (near R?#78) 5v
- 优先级4：
- 低频低内阻
- 镜像电流源
- (near Q?#73) 误差放大输入
- (near Q?#76) Ic3
- (near R?#87) Ir
- (near R?#84) Vbeq2
- (near R?#86) 基准电压2.047V
- (near Q?#77) Ic4
- (near R?#87) Ie1
- (near R?#86) Ic4
- (near R?#86) Vbeq3
- (near Q?#82) Ib3
- (near Q?#81) Ib1
- (near Q?#79) Ie2
- (near Q?#80) Ic2
- (near Q?#83) Ic3
- (near Q?#81) Ic0
- 7805数学计算与分析
- 带隙基准电压计算
- 目标：计算出基准电压Vref、反馈电压以及各个节点电流电压静态工作点
- (near Q?#88) Vbe5
- 假设Vbe = 0.7V
- 通过看1号路线：我们从△Vbe 往上看，找到Vbe1
- Vbe1 是电流镜的电压，其电压值应该为导通三极管的导通压降
- Vbe4
- 所以Vbe1 = 0.7V
- 1号路线：确定Vbe1后，我们发现Vbe2是在带隙基准的一个三极管的集电极
- 三极管处于放电状态等效为可变电阻，无法确定Vce
- (near R?#98) 5v
- (near R?#101) Vref
- (near R?#105) V2
- (near R?#105) V1
- 我们通过2号路线发现，需要将带隙基准的达林顿输出三极管导通，需要至少压降为2个三极管Vbe
- 所以Vbe2 = 2Vbe = 1.4V
- 温漂：△Vbe =  Vt ln（n） = Vt ln（20） =77.3mv
- Vbe6
- (near R?#105) 20△Vbe
- (near R?#105) Vbe2
- (near R?#103) 5V
- V1 = 20 △Vbe  + Vbe2 = 2.9V
- V1 = V2 = 2.9V
- Vbe4电压是以V1作为地参考电压，要保证三极管导通至少Vbe4 - V1 = Vbe
- Vbe4 = V1 + Vbe = 3.6V
- (near Q?#98) Ib1
- (near Q?#96) Vbe1
- (near Q?#96) Ie2
- (near Q?#99) Ib2
- (near Q?#96) ①
- Vbe3
- (near Q?#94) Ic2
- (near Q?#100) Ic3
- 同理分析Vbe5 = Vbe4 + Vbe = 4.3V
- 分析回路3，同理可达Vbe6 = Vbe1 + Vbe = 1.4V
- 各个支路的电流就用电压除了电流即可得到
- (near Q?#95) Ic3
- (near R?#108) Vbeq2
- (near Q?#97) Ic4
- (near Q?#98) ③
- (near R?#114) △Vbe
- (near R?#115) ②
- (near R?#111) Ir
- (near R?#111) Ie1
- (near R?#112) Ic4
- (near R?#112) Vbeq3
- (near Q?#103) Ie2
- (near Q?#105) Ib3
- (near Q?#102) Ic2
- (near Q?#106) Ic3
- 带隙基准为什么是1.2V
- (near Q?#104) Ic0
- (near Q?#104) Ib1

## Library data of the parts
D?#4 = 1N4148W_C7420318: Symbol: 1N4148W_C7420318
E?#1-E?#4 = VCVS_Poly: SimulationGenericComponent: True; Order: 1; Node Names: (1,0); Coefficients List: 0 1
Q1 Q2 Q37 Q43 Q45 Q48 Q49 Q55 Q?#23 Q?#30-Q?#33 Q?#52 Q?#53 Q?#67 Q?#68 Q?#77 Q?#97 = BJT PNP GP: BF: 100; AF: 0; BR: 1; EG: 1.11; FC: 0.5; IS: 1e-16; MJC: 0.33; NC: 2; NE: 1.5; TNOM: 27; VBC_MAX: 1e99; VJC: 0.75; XTI: 3; SimulationGenericComponent: True; CJC: 0; CJE: 0; CJS: 0; CTC: 0; CTE: 0; CTS: 0; IKF: 0; IKR: 0; IRB: 0; ISC: 0; ISE: 0; ISS: 0; ITF: 0; KF: 0; MJE: 0.33; MJS: 0; NF: 1; NKF: 0.5; NR: 1; NS: 1; PTF: 0; RB: 0; RBM: 0; RC: 0; RE: 0; SUBS: 1; TBF1: 0; TBF2: 0; TBR1: 0; TBR2: 0; TF: 0; TIKF1: 0; TIKF2: 0; TIKR1: 0; TIKR2: 0; TIRB1: 0; TIRB2: 0; TIS1: 0; TIS2: 0; TISC1: 0; TISC2: 0; TISE1: 0; TISE2: 0; TITF1: 0; TITF2: 0; TLEV: 0; TLEVC: 0; TMJC1: 0; TMJC2: 0; TMJE1: 0; TMJE2: 0; TMJS1: 0; TMJS2: 0; TNC1: 0; TNC2: 0; TNE1: 0; TNE2: 0; TNF1: 0; TNF2: 0; TNR1: 0; TNR2: 0; TNS1: 0; TNS2: 0; TR: 0; TRB1: 0; TRB2: 0; TRC1: 0; TRC2: 0; TRE1: 0; TRE2: 0; TRM1: 0; TRM2: 0; TTF1: 0; TTF2: 0; TTR1: 0; TTR2: 0; TVAF1: 0; TVAF2: 0; TVAR1: 0; TVAR2: 0; TVJC: 0; TVJE: 0; TVJS: 0; VAF: 0; VAR: 0; VBE_MAX: 1e99; VCE_MAX: 1e99; VJE: 0.75; VJS: 0.75; VTF: 0; XCJC: 1; XTB: 0; XTF: 0
Q16-Q27 Q35 Q36 Q38-Q42 Q44 Q46 Q47 Q50-Q54 Q56-Q61 Q?#1-Q?#22 Q?#24-Q?#29 Q?#34-Q?#51 Q?#54-Q?#66 Q?#69-Q?#76 Q?#78-Q?#96 Q?#98-Q?#106 = BJT NPN VBIC: SimulationGenericComponent: True; AFN: 1; AJC: -0.5; ART: 0.1; AVC1: 0; EA: 1.12; FC: 0.9; IBBE: 1e-06; IBCI: 1e-16; IBEI: 1e-18; MC: 0.33; NCN: 2; NKF: 0.5; PC: 0.75; TNOM: 27; VERS: 1.2; XII: 3; AJE: -0.5; AJS: -0.5; AVC2: 0; BFN: 1; CBCO: 0; CBEO: 0; CCSO: 0; CJC: 0; CJCP: 0; CJE: 0; CJEP: 0; CTH: 0; DEAR: 0; EAIC: 1.12; EAIE: 1.12; EAIS: 1.12; EANC: 1.12; EANE: 1.12; EANS: 1.12; EAP: 1.12; EBBE: 0; GAMM: 0; HRCF: 1; IBCIP: 0; IBCN: 0; IBCNP: 0; IBEIP: 0; IBEN: 0; IBENP: 0; IKF: 0; IKP: 0; IKR: 0; IS: 1e-16; ISP: 0; ISRR: 1; ITF: 0; KFN: 0; ME: 0.33; MS: 0.33; NBBE: 1; NCI: 1; NCIP: 1; NCNP: 2; NEI: 1; NEN: 2; NF: 1; NFP: 1; NR: 1; PE: 0.75; PS: 0.75; QBM: 0; QCO: 0; QTF: 0; RBI: 0.1; RBP: 0.1; RBX: 0; RCI: 0.1; RCX: 0; RE: 0; RS: 0; RTH: 0; TAVC: 0; TD: 0; TF: 0; TNBBE: 0; TNF: 0; TR: 0; TVBBE1: 0; TVBBE2: 0; VBBE: 0; VEF: 0; VER: 0; VO: 0; VREF: 0; VRT: 0; VTF: 0; WBE: 1; WSP: 1; XIKF: 0; XIN: 3; XIS: 3; XISR: 0; XRBI: 0; XRBP: 0; XRBX: 0; XRCI: 0; XRCX: 0; XRE: 0; XRS: 0; XTF: 0; XVO: 0
R8-R19 R29-R45 R47-R56 R?#1 R?#2 R?#5-R?#22 R?#24-R?#46 R?#49-R?#80 R?#82-R?#101 R?#104-R?#119 = Resistor: TC1: 0; SimulationGenericComponent: True; TC2: 0
D1 D2 D?#1-D?#3 D?#5-D?#8 = 1N4148W_C7420318: Symbol: 1N4148W_C7420318
R28 R46 R?#3 R?#4 R?#23 R?#47 R?#48 R?#81 R?#102 R?#103 = 3296W-1-103_C48997937: Symbol: 3296W-1-103_C48997937